# Altium project Hackster1.PrjPcb (part 3 of 4)

## Sheet pca10184_level_shifters.SchDoc: =ProductName + ' - Level Shifters'
size A3; Organization: Nordic Semiconductor; DocumentNumber: 4; SheetNumber: 4; SheetTotal: 9; CompanyName: Nordic Semiconductor; DocumentSize: A4; ProjectName: Hackster1.PrjPcb
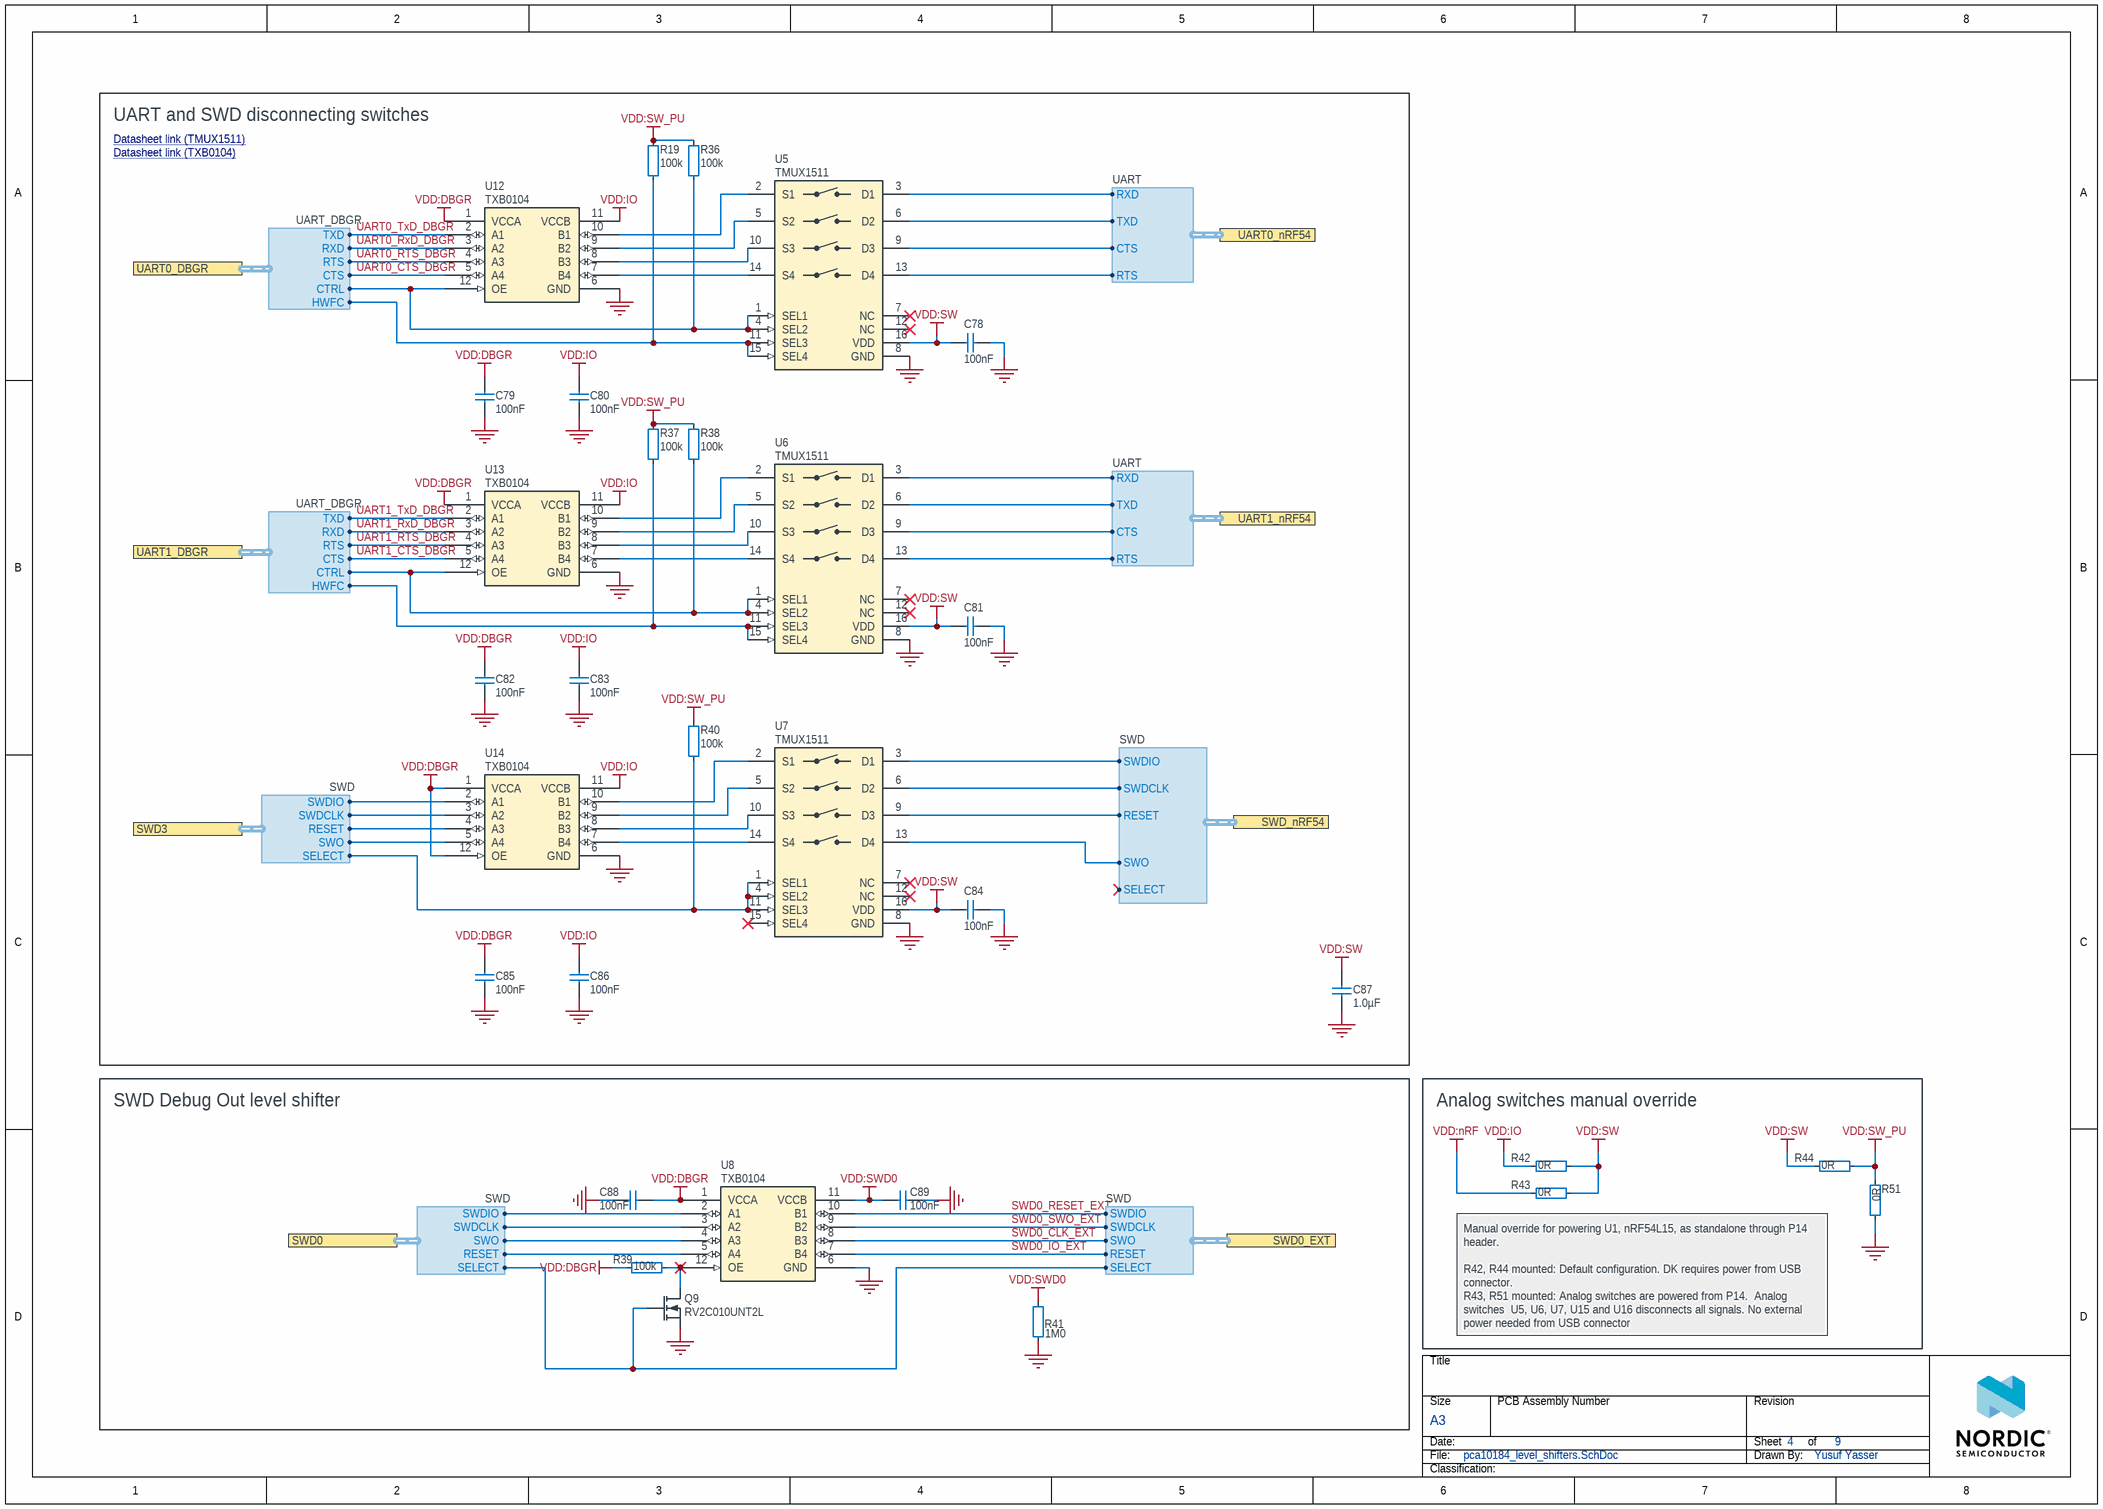
[diagram p7: pca10184_level_shifters.SchDoc]

### Parts
C78  100nF  [CAPC0603X03L_C]
C79  100nF  [CAPC0603X03L_C]
C80  100nF  [CAPC0603X03L_C]
C81  100nF  [CAPC0603X03L_C]
C82  100nF  [CAPC0603X03L_C]
C83  100nF  [CAPC0603X03L_C]
C84  100nF  [CAPC0603X03L_C]
C85  100nF  [CAPC0603X03L_C]
C86  100nF  [CAPC0603X03L_C]
C87  1.0µF  [CAPC1005X04L]
C88  100nF  [CAPC0603X03L_C]
C89  100nF  [CAPC0603X03L_C]
Q9  RV2C010UNT2L  [DFN65P100X40-3L]
R19  100k  [RESC0603X03L_C]
R36  100k  [RESC0603X03L_C]
R37  100k  [RESC0603X03L_C]
R38  100k  [RESC0603X03L_C]
R39  100k  [RESC0603X03L_C]
R40  100k  [RESC0603X03L_C]
R41  1M0  [RESC0603X03L_C]
R42  0R  [RESC1005X04L]
R43  0R  [RESC1005X04L]
R44  0R  [RESC1005X04L]
R51  0R  [RESC1005X04L]
U5  TMUX1511  [XQFN40P180X260X50-16N]
U6  TMUX1511  [XQFN40P180X260X50-16N]
U7  TMUX1511  [XQFN40P180X260X50-16N]
U8  TXB0104  [QFN12P40_170X200X55L50X20]
U12  TXB0104  [QFN12P40_170X200X55L50X20]
U13  TXB0104  [QFN12P40_170X200X55L50X20]
U14  TXB0104  [QFN12P40_170X200X55L50X20]

### Blocks framed on the sheet
UART and SWD disconnecting switches: C78-C87 R19 R36-R38 R40 U5-U7 U12-U14
SWD Debug Out level shifter: C88 C89 Q9 R39 R41 U8
Analog switches manual override: R42-R44 R51

### Ports
SWD0 (harness SWD), SWD0_EXT (harness SWD), SWD3 (harness SWD), SWD_nRF54 (harness SWD), UART0_DBGR (harness UART_DBGR), UART0_nRF54 (harness UART), UART1_DBGR (harness UART_DBGR), UART1_nRF54 (harness UART)

### Harnesses
SWD: SWDIO, SWDCLK, SWO, RESET, SELECT
UART_DBGR: RTS, CTS, RXD, TXD, HWFC, CTRL
UART: RTS, CTS, RXD, TXD

### Nets
GND: C78.2 C79.2 C80.2 C81.2 C82.2 C83.2 C84.2 C85.2 C86.2 C87.1 C88.1 C89.2 Q9.2(S) R41.1 R51.2 U5.8(GND) U6.8(GND) U7.8(GND) U8.6(GND) U12.6(GND) U13.6(GND) U14.6(GND)  [project net ENB]
VDD:DBGR: C79.1 C82.1 C85.1 C88.2 R39.2 U8.1(VCCA) U12.1(VCCA) U13.1(VCCA) U14.1(VCCA) U14.12(OE)
VDD:IO: C80.1 C83.1 C86.1 R42.1 U12.11(VCCB) U13.11(VCCB) U14.11(VCCB)
VDD:nRF: R43.1
VDD:SW: C78.1 C81.1 C84.1 C87.2 R42.2 R43.2 R44.2 U5.16(VDD) U6.16(VDD) U7.16(VDD)
VDD:SW_PU: R19.1 R36.1 R37.1 R38.1 R40.1 R44.1 R51.1
VDD:SWD0: C89.1 R41.2 U8.11(VCCB)
nRF54_RESET: U7.9(D3) ; port SWD_nRF54.RESET
P0.06: U5.6(D2) ; port UART0_nRF54.TXD
P0.07: U5.3(D1) ; port UART0_nRF54.RXD
P0.08: U5.13(D4) ; port UART0_nRF54.RTS
P0.09: U5.9(D3) ; port UART0_nRF54.CTS
P1.16: U6.6(D2) ; port UART1_nRF54.TXD
P1.17: U6.3(D1) ; port UART1_nRF54.RXD
P1.18: U6.13(D4) ; port UART1_nRF54.RTS
P1.19: U6.9(D3) ; port UART1_nRF54.CTS
P2.07: U7.13(D4) ; port SWD_nRF54.SWO
SWD0_CLK_EXT: U8.8(B3) ; port SWD0_EXT.SWO
SWD0_IO_EXT: U8.7(B4) ; port SWD0_EXT.RESET
SWD0_RESET_EXT: U8.10(B1) ; port SWD0_EXT.SWDIO
SWD0_SWO_EXT: U8.9(B2) ; port SWD0_EXT.SWDCLK
SWDCLK: U7.6(D2) ; port SWD_nRF54.SWDCLK
SWDIO: U7.3(D1) ; port SWD_nRF54.SWDIO
UART0_CTS_DBGR: U12.5(A4) ; port UART0_DBGR.CTS
UART0_RTS_DBGR: U12.4(A3) ; port UART0_DBGR.RTS
UART0_RxD_DBGR: U12.3(A2) ; port UART0_DBGR.RXD
UART0_TxD_DBGR: U12.2(A1) ; port UART0_DBGR.TXD
UART1_CTS_DBGR: U13.5(A4) ; port UART1_DBGR.CTS
UART1_RTS_DBGR: U13.4(A3) ; port UART1_DBGR.RTS
UART1_RxD_DBGR: U13.3(A2) ; port UART1_DBGR.RXD
UART1_TxD_DBGR: U13.2(A1) ; port UART1_DBGR.TXD
NetQ9_1: Q9.1(G) ; port SWD0.SELECT, port SWD0_EXT.SELECT
NetQ9_3: Q9.3(D) R39.1 U8.12(OE)
NetR19_2: R19.2 U5.11(SEL3) U5.15(SEL4) ; port UART0_DBGR.HWFC
NetR36_2: R36.2 U5.1(SEL1) U5.4(SEL2) U12.12(OE) ; port UART0_DBGR.CTRL
NetR37_2: R37.2 U6.11(SEL3) U6.15(SEL4) ; port UART1_DBGR.HWFC
NetR38_2: R38.2 U6.1(SEL1) U6.4(SEL2) U13.12(OE) ; port UART1_DBGR.CTRL
NetR40_2: R40.2 U7.1(SEL1) U7.4(SEL2) U7.11(SEL3) ; port SWD3.SELECT
NetU5_2: U5.2(S1) U12.10(B1)
NetU5_5: U5.5(S2) U12.9(B2)
NetU5_10: U5.10(S3) U12.8(B3)
NetU5_14: U5.14(S4) U12.7(B4)
NetU6_2: U6.2(S1) U13.10(B1)
NetU6_5: U6.5(S2) U13.9(B2)
NetU6_10: U6.10(S3) U13.8(B3)
NetU6_14: U6.14(S4) U13.7(B4)
NetU7_2: U7.2(S1) U14.10(B1)
NetU7_5: U7.5(S2) U14.9(B2)
NetU7_10: U7.10(S3) U14.8(B3)
NetU7_14: U7.14(S4) U14.7(B4)
NetU8_2: U8.2(A1) ; port SWD0.SWDIO
NetU8_3: U8.3(A2) ; port SWD0.SWDCLK
NetU8_4: U8.4(A3) ; port SWD0.SWO
NetU8_5: U8.5(A4) ; port SWD0.RESET
NetU14_2: U14.2(A1) ; port SWD3.SWDIO
NetU14_3: U14.3(A2) ; port SWD3.SWDCLK
NetU14_4: U14.4(A3) ; port SWD3.RESET
NetU14_5: U14.5(A4) ; port SWD3.SWO

Not connected (* = marked no-connect by the designer): U5 7(NC)* 12(NC)*; U6 7(NC)* 12(NC)*; U7 7(NC)* 12(NC)* 15(SEL4)*

### Notes on the sheet
- Datasheet link (TMUX1511) <https://www.ti.com/lit/ds/symlink/tmux1511.pdf?ts=1730882090102&ref_url=https%253A%252F%252Fwww.mouser.dk%252F>
- Datasheet link (TXB0104) <https://www.ti.com/lit/ds/symlink/txb0104.pdf?src-supplier=IHS+Markit>
- (near R43) Manual override for powering U1, nRF54L15, as standalone through P14 header.
  R42, R44 mounted: Default configuration. DK requires power from USB connector.
  R43, R51 mounted: Analog switches are powered from P14.  Analog switches  U5, U6, U7, U15 and U16 disconnects all signals. No external power needed from USB connector
- Title
- Size
- Date:
- File:
- A3
- PCB Assembly Number
- Sheet
- Drawn By:
- Revision
- of
- Classification:

### Library data of the parts
C78-C86 C88 C89 = C0201-100n: Capacitor, X5R, ±10%; Manufacturer: N.A.; Part number IPS: 00000001248, 00000002505; Part number Norautron: 262071862; Part number NEMS: 100200078; Pad Count: 2; Note: 16V; Component Status: Active; Part Number: C0201-100n; Value: 100nF; Footprint Doc: 0201; Component Class: Capacitors; Author: rsk; PartId: 100200078; Manufacturer Part Number: N.A.; ComponentLink1URL: N.A.; ComponentLink1Description: Datasheet; ComponentLink2URL: N.A.; ComponentLink2Description: Supplier link; HelpURL: N.A.; LatestRevisionDate: 2017-11-09; Published: 2014-11-13; Supplier 1: N.A.; Supplier Part Number 1: N.A.; Supplier 2: N.A.; Supplier Part Number 2: N.A.; Artikkelnr Noca: N.A.
C87 = C0402-1µ0-6.3V-X5R-10%: Capacitor, X5R, ±10%, 6.3V; Manufacturer: N.A.; Part number Norautron: 26207137; Part number NEMS: 100200498; Pad Count: 2; Component Status: Active; Part Number: C0402-1µ0-6.3V-X5R-10%; Manufacturer Part Number: N.A.; LatestRevisionDate: 2022-01-27; Published: 2022-01-27; Value: 1.0µF; Note: 6.3V; Artikkelnr Noca: N.A.; Footprint Doc: 0402; ComponentLink1URL: N.A.; ComponentLink1Description: Datasheet; ComponentLink2URL: N.A.; ComponentLink2Description: Supplier link; HelpURL: N.A.; Supplier 1: N.A.; Supplier Part Number 1: N.A.; Supplier 2: N.A.; Supplier Part Number 2: N.A.; Part number IPS: N.A.; Component Class: Capacitors; PartId: 100200498; Author: rubr
Q9 = RV2C010UNT2L: N-Channel MOSFET, 20V, 1A, 470mOhm, 400mW, -55°C ~ 150°C; Manufacturer: Rohm Semiconductor; Part number IPS: 00000009976; Part number Norautron: 26320026; Part number NEMS: 101300132; Note: N.A.; Artikkelnr Noca: 35010020; Pad Count: 3; Component Status: Active; Part Number: RV2C010UNT2L; Manufacturer Part Number: RV2C010UNT2L; ComponentLink1URL: N.A.; ComponentLink1Description: Datasheet; ComponentLink2URL: N.A.; ComponentLink2Description: Supplier link; HelpURL: http://rohmfs.rohm.com/en/products/databook/datasheet/discrete/transistor/mosfet/rv2c010unt2l-e.pdf; Footprint Doc: DFN-3; LatestRevisionDate: 2024-09-18; Published: 2016-08-09; Value: RV2C010UNT2L; Supplier 1: Digi-Key; Supplier Part Number 1: RV2C010UNT2LCT-ND; Supplier 2: Mouser; Supplier Part Number 2: 755-RV2C010UNT2L; PartId: 101300132; Component Class: Semiconductors; Author: rsk
R19 R36-R40 = R0201-100k: Resistor, ±1%, 0.05W; Manufacturer: N.A.; Part number IPS: 00000001419; Part number Norautron: 26108487; Part number NEMS: 100100080; Note: Chip Res 1%; Pad Count: 2; Component Status: Active; Part Number: R0201-100k; Manufacturer Part Number: N.A.; ComponentLink1URL: N.A.; ComponentLink1Description: Datasheet; ComponentLink2URL: N.A.; ComponentLink2Description: Supplier link; HelpURL: N.A.; Footprint Doc: 0201; LatestRevisionDate: 2014-11-13; Published: 2014-11-13; Value: 100k; Artikkelnr Noca: N.A.; Supplier 1: N.A.; Supplier Part Number 1: N.A.; Supplier 2: N.A.; Supplier Part Number 2: N.A.; Component Class: Resistors; PartId: 100100080; Author: rsk
R41 = R0201-1M0: Resistor, ±1%, 0.05W; Manufacturer: N.A.; Part number IPS: 00000001418; Part number Norautron: 26107108; Part number NEMS: 100100093; Component Status: Active; Pad Count: 2; Note: Chip Res 1%; Part Number: R0201-1M0; PartId: 100100093; Component Class: Resistors; Author: rsk; Manufacturer Part Number: N.A.; ComponentLink1URL: N.A.; ComponentLink1Description: Datasheet; ComponentLink2URL: N.A.; ComponentLink2Description: Supplier link; HelpURL: N.A.; LatestRevisionDate: 2014-11-13; Published: 2014-11-13; Footprint Doc: 0201; Value: 1M0; Supplier 1: N.A.; Supplier Part Number 1: N.A.; Supplier 2: N.A.; Supplier Part Number 2: N.A.; Artikkelnr Noca: N.A.
R42-R44 R51 = R0402-0R: Resistor, ±5%, 0.063W; Manufacturer: N.A.; Part number IPS: 00000007128; Part number NEMS: 100100109; Component Status: Active; Pad Count: 2; Note: Chip Res 5%; Artikkelnr Noca: 27049000; Part Number: R0402-0R; PartId: 100100109; Component Class: Resistors; Author: rsk; Manufacturer Part Number: N.A.; ComponentLink1URL: N.A.; ComponentLink1Description: Datasheet; ComponentLink2URL: N.A.; ComponentLink2Description: Supplier link; HelpURL: N.A.; LatestRevisionDate: 2009-11-23; Published: 2009-05-08; Footprint Doc: 0402; Value: 0R; Supplier 1: Farnell; Supplier Part Number 1: 146-9661; Supplier 2: N.A.; Supplier Part Number 2: N.A.; Part number Norautron: N.A.
U5-U7 = TMUX1511: Low-Capacitance, 1:1 (SPST) 4-Channel, analog switch; Manufacturer: Texas Instruments; Manufacturer Part Number: TMUX1511RSVR; Part number NEMS: 101900847; Component Status: Active; Pad Count: 16; Note: N.A.; Part Number: TMUX1511; Component Class: Misc_ICs; Author: stl1; ComponentLink1URL: https://www.ti.com/lit/ds/symlink/tmux1511.pdf?ts=1730882090102&ref_url=https%253A%252F%252Fwww.mouser.dk%252F; ComponentLink1Description: Datasheet; ComponentLink2URL: N.A.; ComponentLink2Description: Supplier link; HelpURL: https://www.ti.com/lit/ds/symlink/tmux1511.pdf?ts=1730882090102&ref_url=https%253A%252F%252Fwww.mouser.dk%252F; LatestRevisionDate: 2024-12-05; Published: 2024-12-05; Footprint Doc: UFQFN-16; Value: TMUX1511; Supplier 1: Digi-Key; Supplier Part Number 1: 296-53443-2-ND; Supplier 2: Mouser; Supplier Part Number 2: 595-TMUX1511RSVR; Artikkelnr Noca: N.A.; Part number IPS: N.A.; Part number Norautron: N.A.; PartId: 101900847
U8 U12-U14 = TXB0104RUTR: 4-Bit Bidirectional Level-Shifter/Voltage Translator with Automatic Direction Sensing; Manufacturer: Texas Instruments; Part number NEMS: 101900856; Component Status: Active; Pad Count: 12; Note: Translator, Bidirectional; Artikkelnr Noca: N.A.; Part Number: TXB0104RUTR; Component Class: Misc_ICs; Author: stl1; Manufacturer Part Number: TXB0104RUTR; ComponentLink1URL: N.A.; ComponentLink1Description: Datasheet; ComponentLink2URL: N.A.; ComponentLink2Description: Supplier link; HelpURL: https://www.ti.com/lit/ds/symlink/txb0104.pdf?ts=1738584719537&ref_url=https%253A%252F%252Fwww.mouser.com%252F; LatestRevisionDate: 2025-02-04; Published: 2025-02-04; Footprint Doc: 12-UFQFN; Value: TXB0104; Supplier 1: Digi-Key; Supplier Part Number 1: 296-25888-2-ND; Supplier 2: Mouser; Supplier Part Number 2: 595-TXB0104RUTR; Part number IPS: N.A.; Part number Norautron: N.A.; PartId: 101900856

## Sheet pca10184_switches.SchDoc: =BoardTitle+' - QSPI Switching'
size A3; Organization: Nordic Semiconductor; DocumentNumber: 7; SheetNumber: 7; SheetTotal: 9; CompanyName: Nordic Semiconductor; DocumentSize: A4; ProjectName: Hackster1.PrjPcb
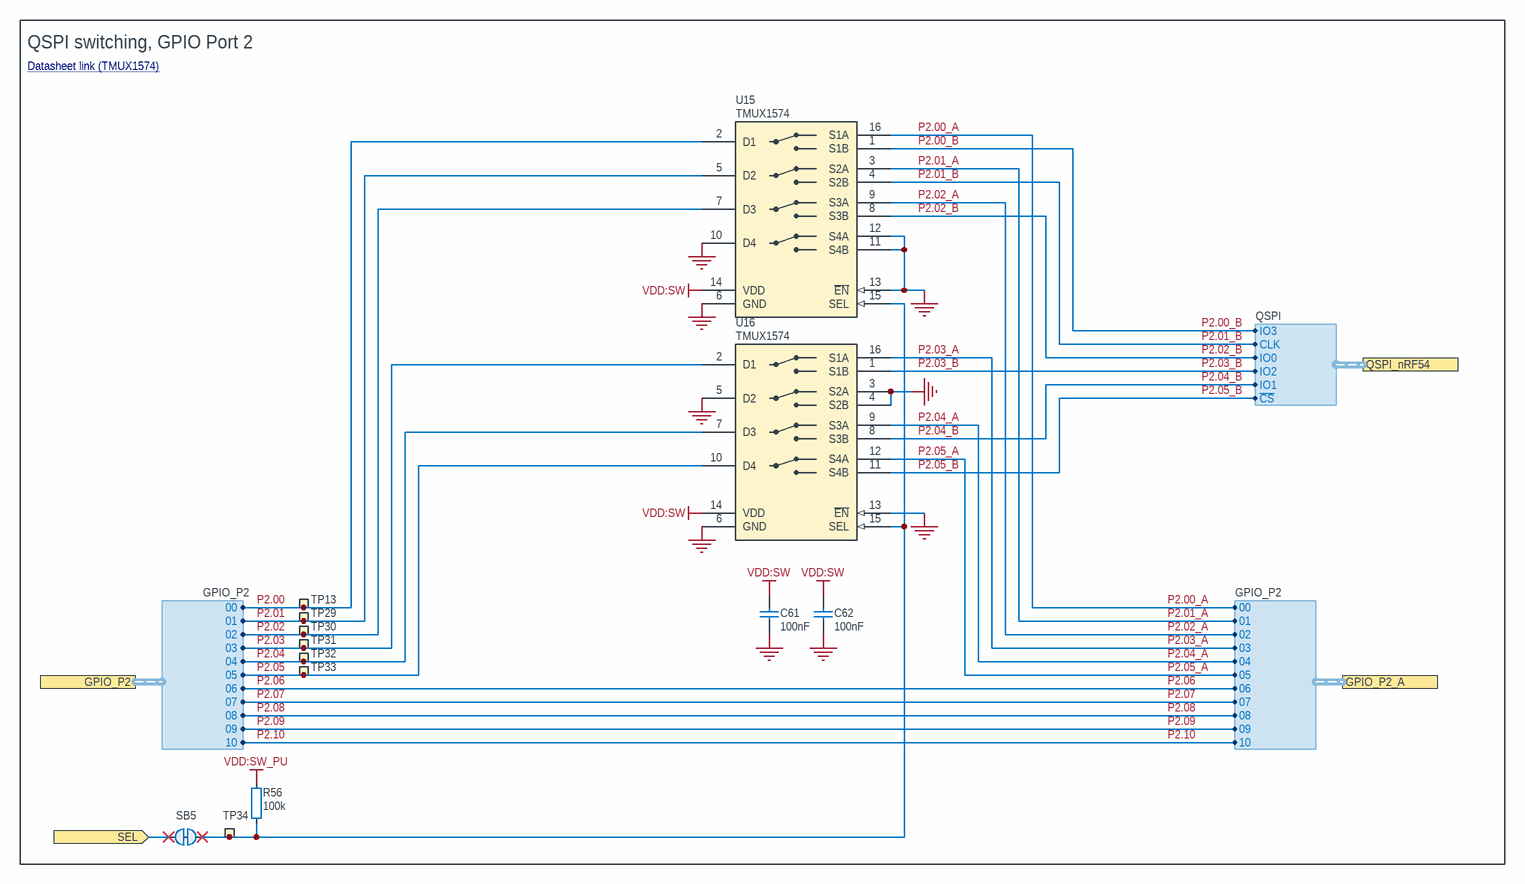
[diagram p8: pca10184_switches.SchDoc]

### Parts
C61  100nF  [CAPC0603X03L_C]
C62  100nF  [CAPC0603X03L_C]
R56  100k  [RESC0603X03L_C]
SB5  Solderbridge  [Solderbridge_Shorted]  (value not drawn)  (net tie, no BOM)
TP13  Ø0.7mm,SMD  [TP_SMD_D0.7mm]  (value not drawn)  (no BOM)
TP29  Ø0.7mm,SMD  [TP_SMD_D0.7mm]  (value not drawn)  (no BOM)
TP30  Ø0.7mm,SMD  [TP_SMD_D0.7mm]  (value not drawn)  (no BOM)
TP31  Ø0.7mm,SMD  [TP_SMD_D0.7mm]  (value not drawn)  (no BOM)
TP32  Ø0.7mm,SMD  [TP_SMD_D0.7mm]  (value not drawn)  (no BOM)
TP33  Ø0.7mm,SMD  [TP_SMD_D0.7mm]  (value not drawn)  (no BOM)
TP34  Ø0.7mm,SMD  [TP_SMD_D0.7mm]  (value not drawn)  (no BOM)
U15  TMUX1574  [XQFN40P180X260X50-16N]
U16  TMUX1574  [XQFN40P180X260X50-16N]

### Ports
GPIO_P2 (harness GPIO_P2), GPIO_P2_A (harness GPIO_P2), QSPI_nRF54 (harness QSPI), SEL (in)

### Harnesses
GPIO_P2: 00, 01, 02, 03, 04, 05, 06, 07, 08, 09, 10
QSPI: ~{CS}, IO0, CLK, IO1, IO2, IO3

### Nets
GND: C61.2 C62.2 U15.6(GND) U15.10(D4) U15.11(S4B) U15.12(S4A) U15.13(~{EN}) U16.3(S2A) U16.4(S2B) U16.5(D2) U16.6(GND) U16.13(~{EN})  [project net ENB]
VDD:SW: C61.1 C62.1 U15.14(VDD) U16.14(VDD)
VDD:SW_PU: R56.2
P2.00: TP13.1 U15.2(D1) ; port GPIO_P2.00
P2.00_A: U15.16(S1A) ; port GPIO_P2_A.00
P2.00_B: U15.1(S1B) ; port QSPI_nRF54.IO3
P2.01: TP29.1 U15.5(D2) ; port GPIO_P2.01
P2.01_A: U15.3(S2A) ; port GPIO_P2_A.01
P2.01_B: U15.4(S2B) ; port QSPI_nRF54.CLK
P2.02: TP30.1 U15.7(D3) ; port GPIO_P2.02
P2.02_A: U15.9(S3A) ; port GPIO_P2_A.02
P2.02_B: U15.8(S3B) ; port QSPI_nRF54.IO0
P2.03: TP31.1 U16.2(D1) ; port GPIO_P2.03
P2.03_A: U16.16(S1A) ; port GPIO_P2_A.03
P2.03_B: U16.1(S1B) ; port QSPI_nRF54.IO2
P2.04: TP32.1 U16.7(D3) ; port GPIO_P2.04
P2.04_A: U16.9(S3A) ; port GPIO_P2_A.04
P2.04_B: U16.8(S3B) ; port QSPI_nRF54.IO1
P2.05: TP33.1 U16.10(D4) ; port GPIO_P2.05
P2.05_A: U16.12(S4A) ; port GPIO_P2_A.05
P2.05_B: U16.11(S4B) ; port QSPI_nRF54.~{CS}
P2.06: port GPIO_P2.06, port GPIO_P2_A.06
P2.07: port GPIO_P2.07, port GPIO_P2_A.07
P2.08: port GPIO_P2.08, port GPIO_P2_A.08
P2.09: port GPIO_P2.09, port GPIO_P2_A.09
P2.10: port GPIO_P2.10, port GPIO_P2_A.10
NetR56_1: R56.1 SB5.2 TP34.1 U15.15(SEL) U16.15(SEL)
NetSB5_1: SB5.1 ; port SEL

### Notes on the sheet
- QSPI switching, GPIO Port 2
- Datasheet link (TMUX1574) <https://www.ti.com/lit/ds/symlink/tmux1574.pdf?ts=1730869182960>
- Title
- Size
- Date:
- File:
- A3
- PCB Assembly Number
- Sheet
- Drawn By:
- Revision
- of
- Classification:

### Library data of the parts
C61 C62 = C0201-100n: as C78-C86 on sheet pca10184_level_shifters; Part Number: C0201-100n; LatestRevisionDate: 2017-11-09; Published: 2014-11-13; Value: 100nF; Footprint Doc: 0201; Component Class: Capacitors; PartId: 100200078; Author: rsk; Manufacturer Part Number: N.A.; ComponentLink1URL: N.A.; ComponentLink1Description: Datasheet; ComponentLink2URL: N.A.; ComponentLink2Description: Supplier link; HelpURL: N.A.; Supplier 1: N.A.; Supplier Part Number 1: N.A.; Supplier 2: N.A.; Supplier Part Number 2: N.A.; Artikkelnr Noca: N.A.
R56 = R0201-100k: as R19 on sheet pca10184_level_shifters; Part Number: R0201-100k; Manufacturer Part Number: N.A.; ComponentLink1URL: N.A.; ComponentLink1Description: Datasheet; ComponentLink2URL: N.A.; ComponentLink2Description: Supplier link; HelpURL: N.A.; Footprint Doc: 0201; LatestRevisionDate: 2014-11-13; Published: 2014-11-13; Value: 100k; Artikkelnr Noca: N.A.; Supplier 1: N.A.; Supplier Part Number 1: N.A.; Supplier 2: N.A.; Supplier Part Number 2: N.A.; Component Class: Resistors; PartId: 100100080; Author: rsk
SB5 = Solderbridge Shorted: Shorted Solderbridge; Manufacturer: N.A.; Part number NEMS: 100500459; Pad Count: 2; Component Status: Active; System: Connector; Part Number: Solderbridge Shorted; Manufacturer Part Number: N.A.; LatestRevisionDate: 2012-08-07; Published: 2012-08-07; Value: Solderbridge; Note: N.A.; Artikkelnr Noca: N.A.; Footprint Doc: Solderbridge_Shorted; Part number IPS: N.A.; ComponentLink1URL: N.A.; ComponentLink1Description: Datasheet; ComponentLink2URL: N.A.; ComponentLink2Description: Supplier link; HelpURL: N.A.; Supplier 1: N.A.; Supplier Part Number 1: N.A.; Supplier 2: N.A.; Supplier Part Number 2: N.A.; Component Class: Connectors; PartId: 100500459; Author: rsk; Part number Norautron: N.A.
TP13 TP29-TP34 = TP_SMD_Ø0.7MM: 0.7mm circular SMD testpad; Manufacturer: Nordic Semiconductor; Manufacturer Part Number: N.A.; Part number NEMS: 100500474; Component Status: Active; Pad Count: 1; Part Number: TP_SMD_Ø0.7MM; PartId: 100500474; Component Class: Connectors; Author: rsk; ComponentLink1URL: N.A.; ComponentLink1Description: Datasheet; ComponentLink2URL: N.A.; ComponentLink2Description: Supplier link; HelpURL: N.A.; LatestRevisionDate: 2021-03-05; Published: 2017-12-14; Footprint Doc: TP_SMD_Ø0.7mm; Value: Ø0.7mm,SMD; Note: N.A.; Supplier 1: N.A.; Supplier Part Number 1: N.A.; Supplier 2: N.A.; Supplier Part Number 2: N.A.; Artikkelnr Noca: N.A.; Part number IPS: N.A.; Part number Norautron: N.A.
U15 U16 = TMUX1574: Low-Capacitance, 2:1 (SPDT) 4-Channel, analog switch; Manufacturer: Texas Instruments; Manufacturer Part Number: TMUX1574RSVR; Part number NEMS: 101900850; Component Status: Active; Pad Count: 16; Note: N.A.; Part Number: TMUX1574; Component Class: Misc_ICs; Author: stl1; ComponentLink1URL: https://www.ti.com/lit/ds/symlink/tmux1574.pdf?ts=1730869182960; ComponentLink1Description: Datasheet; ComponentLink2URL: N.A.; ComponentLink2Description: Supplier link; HelpURL: https://www.ti.com/lit/ds/symlink/tmux1574.pdf?ts=1730869182960; LatestRevisionDate: 2024-11-20; Published: 2024-11-20; Footprint Doc: UFQFN-16; Value: TMUX1574; Supplier 1: Digi-Key; Supplier Part Number 1: 296-53445-2-ND; Supplier 2: Mouser; Supplier Part Number 2: 595-TMUX1574RSVR; Artikkelnr Noca: N.A.; Part number IPS: N.A.; Part number Norautron: N.A.; PartId: 101900850

## Sheet MAX3485Schmematic.SchDoc: Rs
size A4; DrawnBy: Yusuf Yasser; SheetNumber: 3; SheetTotal: 17
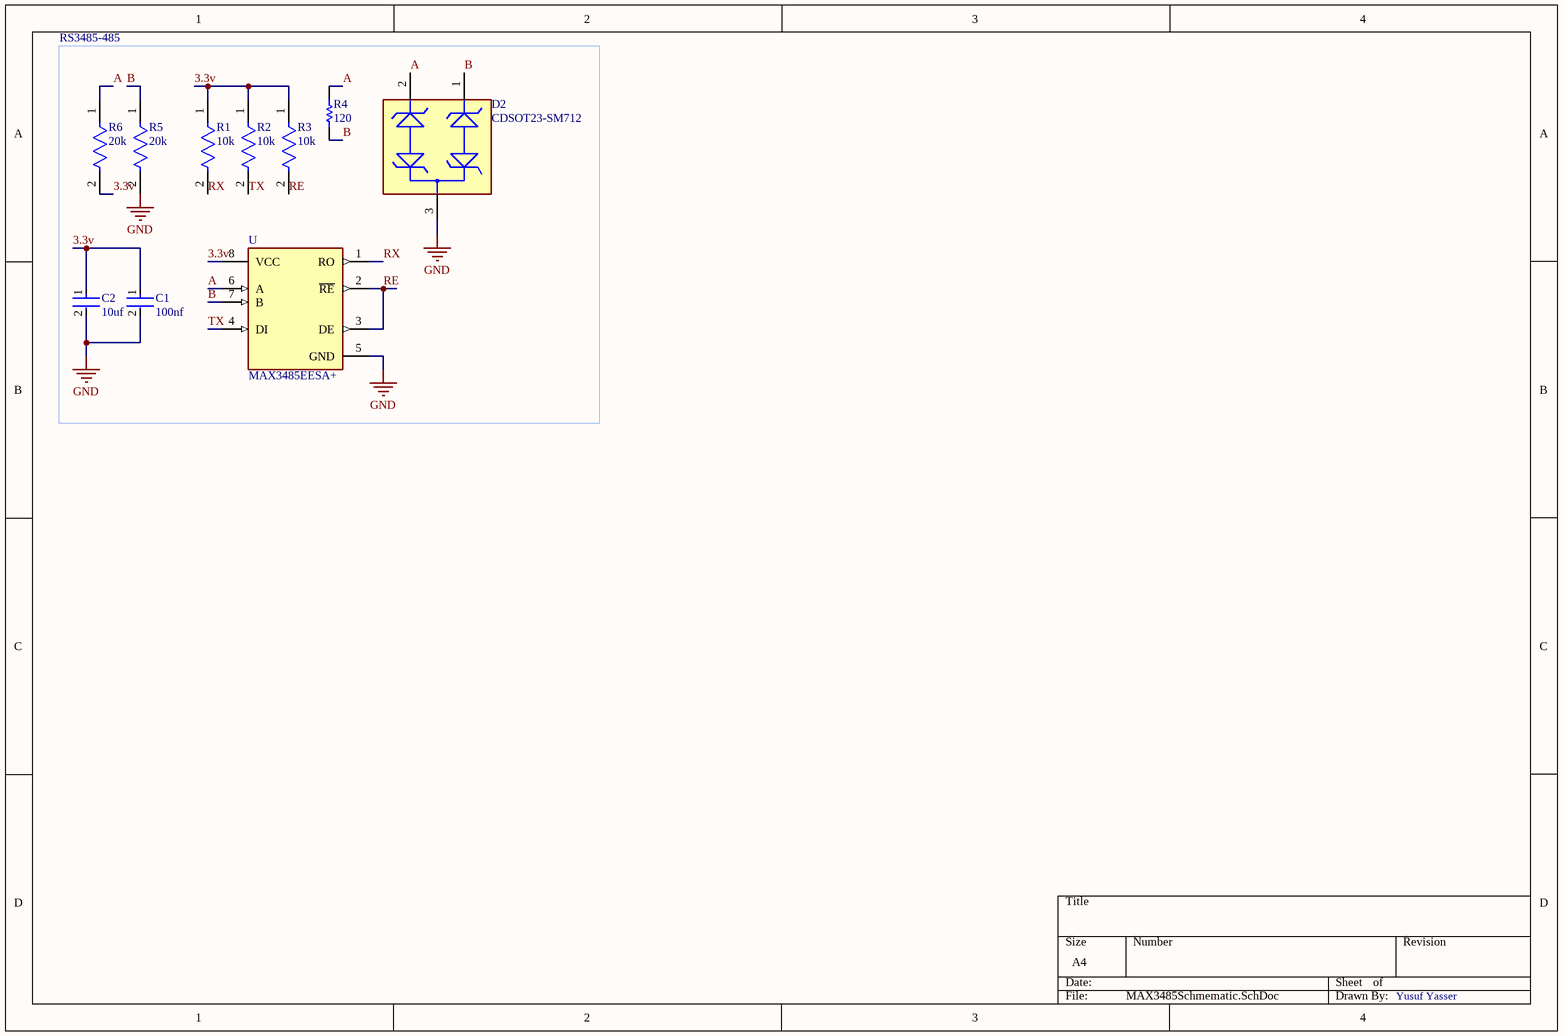
[diagram p9: MAX3485Schmematic.SchDoc]

### Parts
(Parts that share a designator on the sheet are numbered #1, #2 ... from top to bottom, then left to right.)
C1#2  100nf  [FP-CGA1A-0_1-0_03-IPC_A]
C2#2  10uf  [FP-KRM55L-6_1_5_3_3_1_2-C-MFG]
D2#1  CDSOT23-SM712  [FP-SOT23-MFG]
R1#2  10k  [FP-CRGCQ1206-IPC_C]
R2#2  10k  [FP-CRGCQ1206-IPC_C]
R3#2  10k  [FP-CRGCQ1206-IPC_C]
R4#2  120  [RESC3225X60X45NL20T20]
R5#1  20k  [FP-RP732B-MFG]
R6  20k  [FP-RP732B-MFG]
U  MAX3485EESA+  [FP-S8-5-MFG]

### Blocks framed on the sheet
RS3485-485: C1#2 C2#2 D2#1 R1#2 R2#2 R3#2 R4#2 R5#1 R6 U

### Nets
GND: C1#2.2 C2#2.2 D2#1.3 R5#1.2 U.5(GND)  [project net ENB]
3.3v: C1#2.1 C2#2.1 R1#2.1 R2#2.1 R3#2.1 R6.2 U.8(VCC)
A: D2#1.2 R4#2.1 R6.1 U.6(A)
B: D2#1.1 R4#2.2 R5#1.1 U.7(B)
RE: R3#2.2 U.2(~{RE}) U.3(DE)
RX: R1#2.2 U.1(RO)
TX: R2#2.2 U.4(DI)

### Notes on the sheet
- Yusuf Yasser

### Library data of the parts
C1#2 = CMP-08246-000333-1: AUTOMOTIVE GRADE,0201,X7T,4V,0.1
C2#2 = CMP-06035-048273-1: Cap Ceramic Multilayer 10uF 35V ±10% 2220 Emboss T/R
D2#1 = CMP-2000-05081-2: TVS DIODE 7V/12V 14V/26V SOT23-3; Manufacturer: Bourns Inc.; Peak Pulse Current: 17A; Standoff Height: 0.05mm; Breakdown Voltage: 7.5V; Direction: Bidirectional; Clamping Voltage: 26V; Value: 75pF; Number Of Channels: 2; Reverse Standoff Voltage: 12V; Peak Pulse Power: 400W; Temperature Range Low: -55°C; Mouser Description: Transient Voltage Suppressor, TVS, CDSOT23 Series, Unidirectional, 12 V, SOT-23, 3, 13.3 V; Device Class L3: unset; Package: SOT23; Height: 1.17mm; RoHS: TRUE; Octopart: https://octopart.com/cdsot23-sm712-bourns-7576327; Category: Diode; Ipc Land Pattern Name: SOT95P229X103-3; ComponentLink2URL: https://www.bourns.com/docs/Product-Datasheets/CDSOT23-SM712.pdf; Temperature Range High: +150°C; ComponentLink2Description: Datasheet; Digikey Description: TVS DIODE 7V/12V 14V/26V SOT23-3; Manufacturer Part Number: CDSOT23-SM712; Temperature: -55°C to +150°C; Device Class L2: TVS Diodes; Lead Free: Yes; Device Class L1: Circuit Protection; Automotive: No; Capacitance: 75pF
R1#2 R2#2 R3#2 = CMP-03211-010884-1: CRGCQ1206 10KΩ 0.25W 1% ±100ppm/°C 200V; Manufacturer: TE Connectivity; Manufacturer Part Number: CRGCQ1206F10K; Tolerance: 0.01; Automotive Grade: Grade 913; Value: 10KΩ; Automotive: Yes; Temperature: -55°C to +155°C; RoHS: TRUE; Series: CRGCQ; Lead Free: Yes; Device Class L3: Chip SMD Resistors; Package: CRGCQ1206; ComponentLink2URL: https://www.te.com/commerce/DocumentDelivery/DDEController?Action=showdoc&DocId=Data+Sheet%7F1773204-3%7F1%7Fpdf%7FEnglish%7FENG_DS_1773204-3_1.pdf%7F4-2176347-922; Ipc Land Pattern Name: RESC310155X55; Composition: Thick Film; Voltage Rating: 200V; Device Class L1: Passive Components; Temperature Range Low: -55°C; Resistance: 10KΩ; Height: 0.65mm; Power Rating: 0.25W; Device Class L2: Resistors; Temperature Range High: +155°C; Octopart: https://octopart.com/crgcq1206f10k-te+connectivity-91018244; Ambient Temperature Range High: +70°C; ComponentLink2Description: Datasheet; Temperature Coefficient: ±100ppm/°C; Category: Res
R4#2 = CMP-2005-00658-1: Manufacturer: Vishay Dale; Part Number: CRCW1210120RJNTA
R5#1 R6 = CMP-03211-001372-1: Res Thin Film 1206 20KΩ 0.1% 0.25W 15ppm/°C Molded SMD; Manufacturer Part Number: RP73D2B20KBTG; Manufacturer: TE Connectivity; Voltage Rating: 200V; Height: 0.65mm; Ipc Land Pattern Name: RESC305155X55; octopart_url: https://octopart.com/rp73d2b20kbtg-te+connectivity-42012488; RoHS: TRUE; Value: 20KΩ; Temperature: -55°C to 155°C; packaging: 250 cut tape length; ComponentLink2Description: Datasheet; Device Class L1: Passive Components; Category: Res; Resistance: 20KΩ; Automotive: No; ComponentLink2URL: https://www.te.com/commerce/DocumentDelivery/DDEController?Action=showdoc&DocId=Data+Sheet%7F1773272%7FL%7Fpdf%7FEnglish%7FENG_DS_1773272_L.pdf%7F8-1879255-6; Composition: Thin Film; Temperature Range Low: -55°C; Device Class L3: Chip SMD Resistors; Temperature Coefficient: 15ppm/°C; Octopart: https://octopart.com/rp73d2b20kbtg-te+connectivity-42012488; Power Rating: 0.25W; Tolerance: 0.1%; Lead Free: Yes; Package: RP732B; Series: RP73; Temperature Range High: 155°C; Device Class L2: Resistors
U = CMP-05679-000038-1: IC TXRX RS485/422 10MBPS 8SOIC; Manufacturer: Maxim Integrated; Number Of Receivers: 1; Simplex Duplex: Half Duplex; Data Rate: 15Mbits/s; Interface: RS-485,RS-422; Max Supply Voltage: 3.6V; Nominal Supply Current: 0.95-1.1mA; Min Supply Voltage: 3V; Standoff Height: 0.1mm; Mouser Description: RS-422/RS-485 Interface IC 3.3V 12Mbps Transceiver; Lead Free: Yes; Footprint Url: https://pdfserv.maximintegrated.com/land_patterns/90-0096.PDF; Device Class L1: Integrated Circuits (ICs); Device Class L3: RS-232 / RS-422 / RS-485 Interface ICs; RoHS: TRUE; Height: 1.75mm; ComponentLink2URL: https://datasheets.maximintegrated.com/en/ds/MAX3483E-MAX3491E.pdf; Temperature Range High: +85°C; Temperature: -40°C to +85°C; Manufacturer Part Number: MAX3485EESA+; Number Of Transmitters: 1; Device Class L2: Interface ICs; Octopart: https://octopart.com/max3485eesa%2B-maxim+integrated-39731903; ComponentLink2Description: Datasheet; Category: IC; Digikey Description: IC TXRX RS485/422 10MBPS 8SOIC; Automotive: No; Temperature Range Low: -40°C; Package: S8-5

## Sheet Mechanical_design_of_the_sensor.SchDoc
size A4; DrawnBy: Yusuf Yasser; SheetNumber: 3; SheetTotal: 11
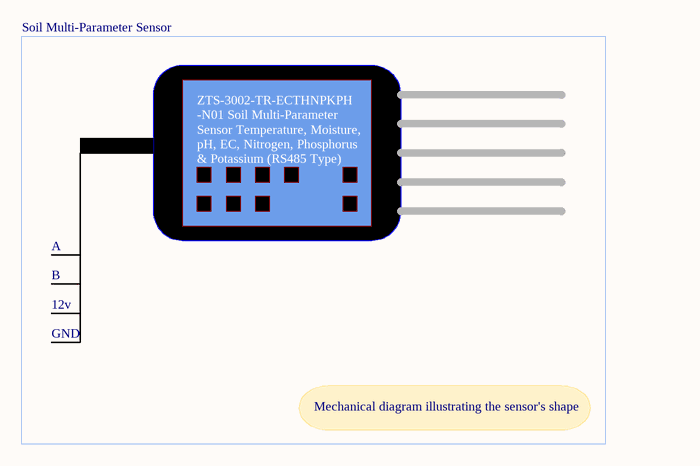
[diagram p10: Mechanical_design_of_the_sensor.SchDoc]

### Notes on the sheet
- Soil Multi-Parameter Sensor
- ZTS-3002-TR-ECTHNPKPH
- -N01 Soil Multi-Parameter
- Sensor Temperature, Moisture,
- pH, EC, Nitrogen, Phosphorus
- & Potassium (RS485 Type)
- A
- B
- 12v
- GND
- Mechanical diagram illustrating the sensor's shape

## Sheet 1_LiPo_Charger.schdoc
size 289 x 200 mm; Name: default297x210; Symbol: default297x210; Device: default297x210; Size: "A4"; Id: /; File: LiPo Charger; Sheet: /; SheetNumber: 12; SheetTotal: 17
Used 2 times, as channels Battery Charger, Battery Charger. Parts and nets are listed once, with the designators drawn on the sheet.
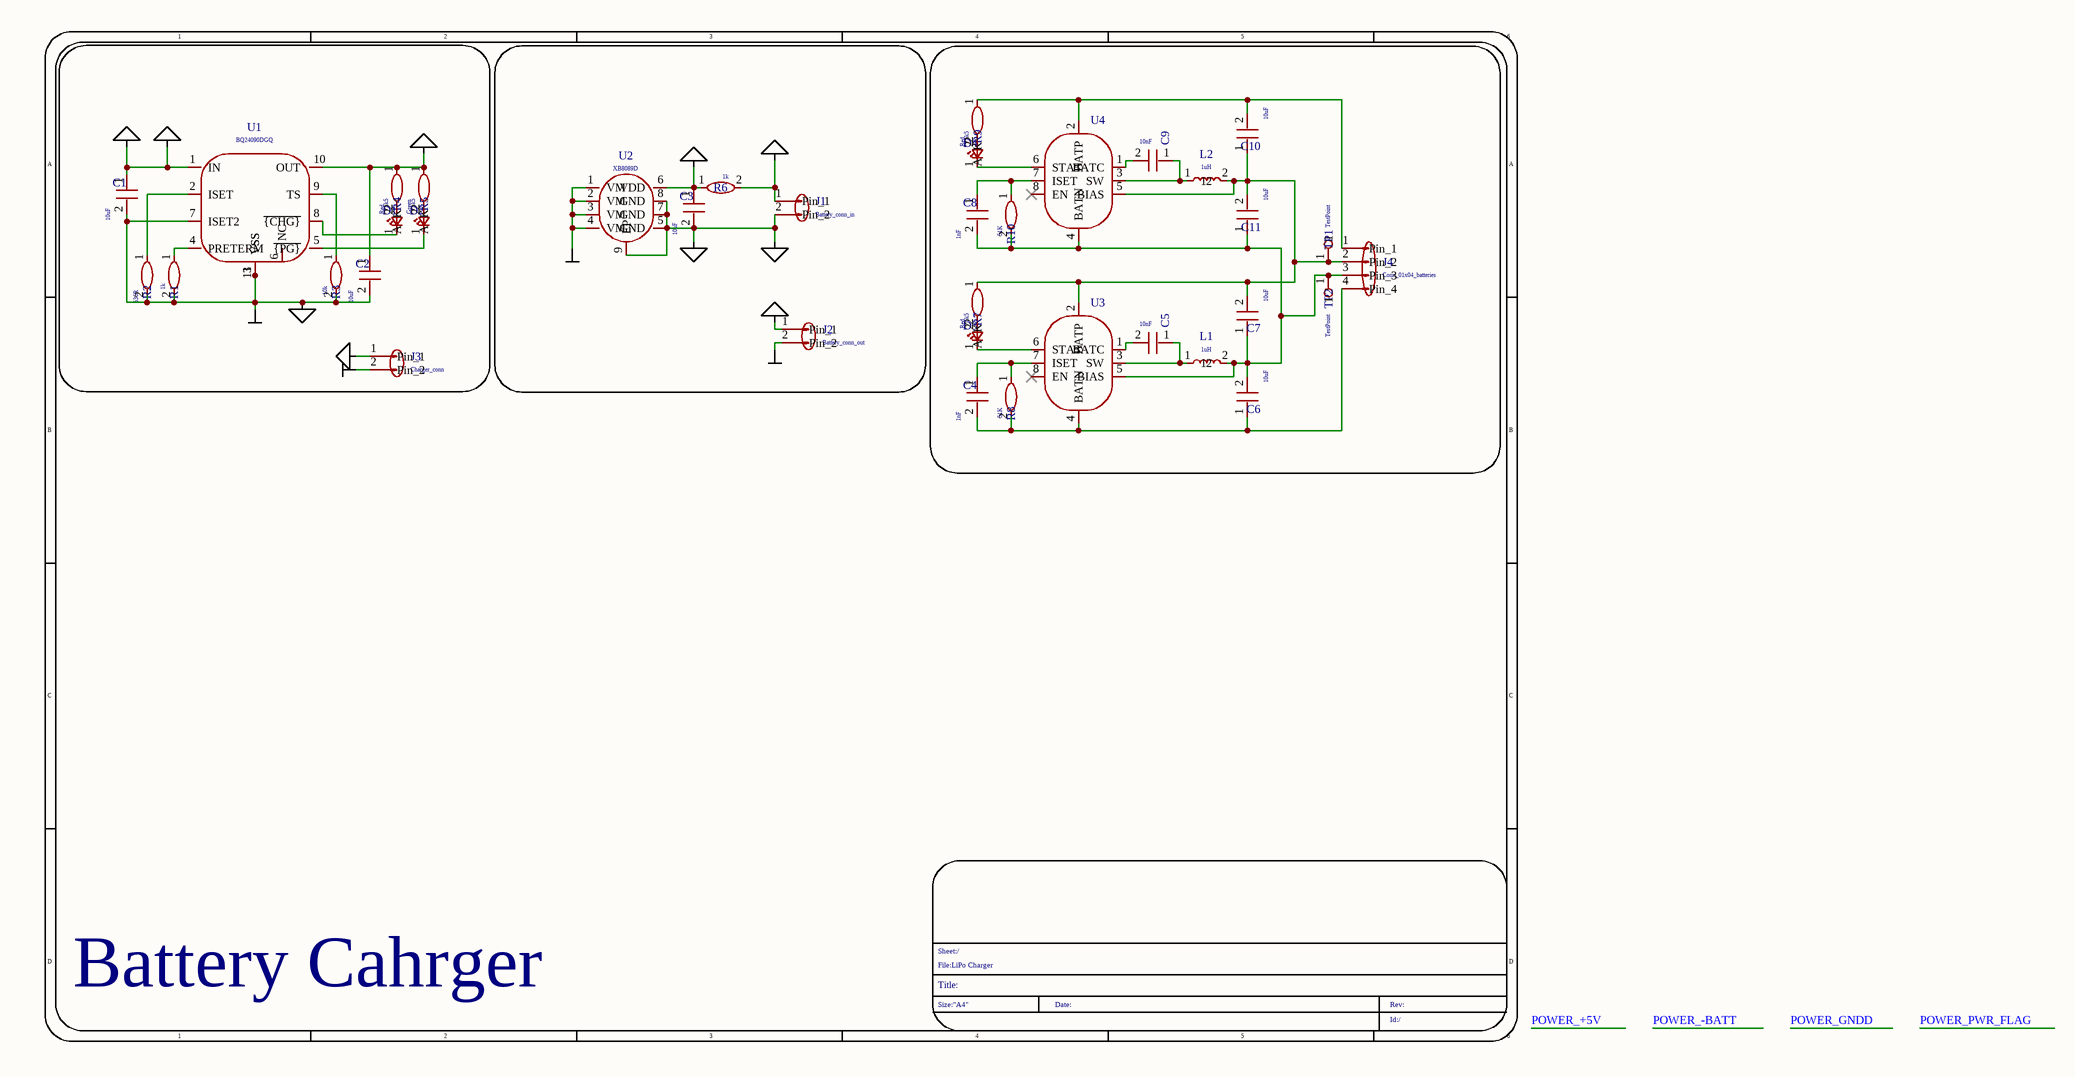
[diagram p11: 1_LiPo_Charger.schdoc]

### Parts
C1  value 10uF  [Capacitor_SMD:C_0402_1005Metric_Pad0.74x0.62mm_HandSolder]  (hidden comment: Device_C)
C2  value 10uF  [Capacitor_SMD:C_0402_1005Metric_Pad0.74x0.62mm_HandSolder]  (hidden comment: Device_C)
C3  value 10uF  [Capacitor_SMD:C_0402_1005Metric_Pad0.74x0.62mm_HandSolder]  (hidden comment: Device_C)
C4  value 1nF  [Capacitor_SMD:C_0402_1005Metric_Pad0.74x0.62mm_HandSolder]  (hidden comment: Device_C)
C5  value 10nF  [Capacitor_SMD:C_0402_1005Metric_Pad0.74x0.62mm_HandSolder]  (hidden comment: Device_C)
C6  value 10uF  [Capacitor_SMD:C_0402_1005Metric_Pad0.74x0.62mm_HandSolder]  (hidden comment: Device_C)
C7  value 10uF  [Capacitor_SMD:C_0402_1005Metric_Pad0.74x0.62mm_HandSolder]  (hidden comment: Device_C)
C8  value 1nF  [Capacitor_SMD:C_0402_1005Metric_Pad0.74x0.62mm_HandSolder]  (hidden comment: Device_C)
C9  value 10nF  [Capacitor_SMD:C_0402_1005Metric_Pad0.74x0.62mm_HandSolder]  (hidden comment: Device_C)
C10  value 10uF  [Capacitor_SMD:C_0402_1005Metric_Pad0.74x0.62mm_HandSolder]  (hidden comment: Device_C)
C11  value 10uF  [Capacitor_SMD:C_0402_1005Metric_Pad0.74x0.62mm_HandSolder]  (hidden comment: Device_C)
D1  value Red  [SparkFun-LED:LED_0603_1608Metric_Red]  (hidden comment: SparkFun-LED_LED_Red_0603)
D2  value Green  [SparkFun-LED:LED_0603_1608Metric_Green]  (hidden comment: SparkFun-LED_LED_Green_0603)
D3  value Red  [SparkFun-LED:LED_0603_1608Metric_Red]  (hidden comment: SparkFun-LED_LED_Red_0603)
D4  value Red  [SparkFun-LED:LED_0603_1608Metric_Red]  (hidden comment: SparkFun-LED_LED_Red_0603)
J1  value Battery_conn_in  [Connector_JST:JST_PH_B2B-PH-K_1x02_P2.00mm_Vertical]  (hidden comment: Connector_Generic_Conn_01x02)
J2  value Battery_conn_out  [Connector_JST:JST_PH_B2B-PH-K_1x02_P2.00mm_Vertical]  (hidden comment: Connector_Generic_Conn_01x02)
J3  value Charger_conn  [Connector_JST:JST_PH_B2B-PH-K_1x02_P2.00mm_Vertical]  (hidden comment: Connector_Generic_Conn_01x02)
J4  value Conn_01x04_batteries  [Connector_JST:JST_EH_B4B-EH-A_1x04_P2.50mm_Vertical]  (hidden comment: Connector_Generic_Conn_01x04)
L1  value 1uH  [Inductor_SMD:L_Sunlord_SWPA3010S]  (hidden comment: Device_L)
L2  value 1uH  [Inductor_SMD:L_Sunlord_SWPA3010S]  (hidden comment: Device_L)
R1  value 1k  [PCM_Resistor_SMD_AKL:R_0201_0603Metric_Pad0.64x0.40mm_HandSolder]  (hidden comment: Device_R)
R2  value 536R  [PCM_Resistor_SMD_AKL:R_0201_0603Metric_Pad0.64x0.40mm_HandSolder]  (hidden comment: Device_R)
R3  value 10k  [PCM_Resistor_SMD_AKL:R_0201_0603Metric_Pad0.64x0.40mm_HandSolder]  (hidden comment: Device_R)
R4  value 1k5  [PCM_Resistor_SMD_AKL:R_0201_0603Metric_Pad0.64x0.40mm_HandSolder]  (hidden comment: Device_R)
R5  value 1k5  [PCM_Resistor_SMD_AKL:R_0201_0603Metric_Pad0.64x0.40mm_HandSolder]  (hidden comment: Device_R)
R6  value 1k  [PCM_Resistor_SMD_AKL:R_0201_0603Metric_Pad0.64x0.40mm_HandSolder]  (hidden comment: Device_R)
R7  value 1k5  [PCM_Resistor_SMD_AKL:R_0201_0603Metric_Pad0.64x0.40mm_HandSolder]  (hidden comment: Device_R)
R8  value 51K  [PCM_Resistor_SMD_AKL:R_0201_0603Metric_Pad0.64x0.40mm_HandSolder]  (hidden comment: Device_R)
R9  value 1k5  [PCM_Resistor_SMD_AKL:R_0201_0603Metric_Pad0.64x0.40mm_HandSolder]  (hidden comment: Device_R)
R10  value 51K  [PCM_Resistor_SMD_AKL:R_0201_0603Metric_Pad0.64x0.40mm_HandSolder]  (hidden comment: Device_R)
TP1  value TestPoint  [TestPoint:TestPoint_Pad_D1.5mm]  (hidden comment: Connector_TestPoint)
TP2  value TestPoint  [TestPoint:TestPoint_Pad_D1.5mm]  (hidden comment: Connector_TestPoint)
U1  value BQ24090DGQ  [Package_SO:HVSSOP-10-1EP_3x3mm_P0.5mm_EP1.57x1.88mm_ThermalVias]  (hidden comment: Battery_Management_BQ24090DGQ)
U2  value XB8089D  [Package_SO:HTSOP-8-1EP_3.9x4.9mm_P1.27mm_EP2.4x3.2mm_ThermalVias]  (hidden comment: Chineness_XB8089D)
U3  Chineness_ETA3000  [Package_DFN_QFN:DFN-8-1EP_2x2mm_P0.5mm_EP0.6x1.2mm]  (value not drawn)
U4  Chineness_ETA3000  [Package_DFN_QFN:DFN-8-1EP_2x2mm_P0.5mm_EP0.6x1.2mm]  (value not drawn)

### Nets
POWER_+5V: C1.1 C1.2 C2.2 C3.1 C3.2 J1.2(Pin_2) J2.2(Pin_2) J3.1(Pin_1) J3.2(Pin_2) R1.2 R2.2 R3.2 R6.1 U1.1(IN) U1.3(VSS) U1.7(ISET2) U1.11(VSS) U2.1(VM) U2.2(VM) U2.3(VM) U2.4(VM) U2.5(GND) U2.6(VDD) U2.7(GND) U2.8(GND) U2.9(EP)  [also labelled POWER_-BATT, POWER_GNDD, POWER_PWR_FLAG]
POWER_+BATT: C2.1 J1.1(Pin_1) J2.1(Pin_1) R4.1 R5.1 R6.2 U1.10(OUT)
NetC4_1: C4.1 R8.1 U3.7(ISET)
NetC4_2: C4.2 C6.1 J4.4(Pin_4) R8.2 U3.4(BATN)
NetC5_1: C5.1 L1.1 U3.3(SW)
NetC5_2: C5.2 U3.1(BATC)
NetC6_2: C6.2 C7.1 C8.2 C11.1 J4.3(Pin_3) L1.2 R10.2 TP2.1 U3.5(BIAS) U4.4(BATN)
NetC7_2: C7.2 C10.1 C11.2 J4.2(Pin_2) L2.2 R7.1 TP1.1 U3.2(BATP) U4.5(BIAS)
NetC8_1: C8.1 R10.1 U4.7(ISET)
NetC9_1: C9.1 L2.1 U4.3(SW)
NetC9_2: C9.2 U4.1(BATC)
NetC10_2: C10.2 J4.1(Pin_1) R9.1 U4.2(BATP)
NetD1_1: D1.1(K) U1.8(~{{CHG}})
NetD1_2: D1.2(A) R4.2
NetD2_1: D2.1(K) U1.5(~{{PG}})
NetD2_2: D2.2(A) R5.2
NetD3_1: D3.1(K) U3.6(STAT)
NetD3_2: D3.2(A) R7.2
NetD4_1: D4.1(K) U4.6(STAT)
NetD4_2: D4.2(A) R9.2
NetR1_1: R1.1 U1.4(PRETERM)
NetR2_1: R2.1 U1.2(ISET)
NetR3_1: R3.1 U1.9(TS)

Not connected (* = marked no-connect by the designer): U1 6(NC); U3 8(EN)*; U4 8(EN)*

### Channels
Battery Charger: designators end in _Battery_Charger#1
Battery Charger: designators end in _Battery_Charger#2

### Notes on the sheet
- Battery Cahrger
- 1
- 2
- 3
- 4
- 5
- 6
- A
- B
- C
- D
- File:LiPo Charger
- Sheet:/
- Size:"A4"
- Title:
- Date:
- Rev:
- Id:/

### Library data of the parts
C1-C11 = Device_C: Users: REF**; ki_fp_filters: C_*; Add into BOM: yes; Symbol: Device_C; Device: Device_C; datasheet: ~; User doc link: ~; Convert to PCB: yes; Origin Footprint: Capacitor_SMD:C_0402_1005Metric_Pad0.74x0.62mm_HandSolder
D1 D3 D4 = SparkFun-LED_LED_Red_0603: prod_id: DIO-17976; ki_fp_filters: LED* LED_SMD:* LED_THT:*; Add into BOM: yes; Symbol: SparkFun-LED_LED_Red_0603; Device: SparkFun-LED_LED_Red_0603; datasheet: https://docs.broadcom.com/docs/AV02-0551EN; User doc link: https://docs.broadcom.com/docs/AV02-0551EN; Convert to PCB: yes; Origin Footprint: SparkFun-LED:LED_0603_1608Metric_Red; PROD_ID: DIO-17976
D2 = SparkFun-LED_LED_Green_0603: prod_id: DIO-00821; ki_fp_filters: LED* LED_SMD:* LED_THT:*; Add into BOM: yes; Symbol: SparkFun-LED_LED_Green_0603; Device: SparkFun-LED_LED_Green_0603; datasheet: https://docs.broadcom.com/docs/AV02-0551EN; User doc link: https://docs.broadcom.com/docs/AV02-0551EN; Convert to PCB: yes; Origin Footprint: SparkFun-LED:LED_0603_1608Metric_Green; PROD_ID: DIO-00821
J1-J3 = Connector_Generic_Conn_01x02: Users: REF**; ki_fp_filters: Connector*:*_1x??_*; Add into BOM: yes; Symbol: Connector_Generic_Conn_01x02; Device: Connector_Generic_Conn_01x02; datasheet: ~; User doc link: ~; Convert to PCB: yes; Origin Footprint: Connector_JST:JST_PH_B2B-PH-K_1x02_P2.00mm_Vertical
J4 = Connector_Generic_Conn_01x04: Users: REF**; ki_fp_filters: Connector*:*_1x??_*; Add into BOM: yes; Symbol: Connector_Generic_Conn_01x04; Device: Connector_Generic_Conn_01x04; datasheet: ~; User doc link: ~; Convert to PCB: yes; Origin Footprint: Connector_JST:JST_EH_B4B-EH-A_1x04_P2.50mm_Vertical
L1 L2 = Device_L: Users: REF**; ki_fp_filters: Choke_* *Coil* Inductor_* L_*; Add into BOM: yes; Symbol: Device_L; Device: Device_L; datasheet: ~; User doc link: ~; Convert to PCB: yes; Origin Footprint: Inductor_SMD:L_Sunlord_SWPA3010S
R1-R10 = Device_R: Users: REF**; ki_fp_filters: R_*; Add into BOM: yes; Symbol: Device_R; Device: Device_R; datasheet: ~; User doc link: ~; Convert to PCB: yes; Origin Footprint: PCM_Resistor_SMD_AKL:R_0201_0603Metric_Pad0.64x0.40mm_HandSolder
TP1 TP2 = Connector_TestPoint: Users: REF**; ki_fp_filters: Pin* Test*; Add into BOM: yes; Symbol: Connector_TestPoint; Device: Connector_TestPoint; datasheet: ~; User doc link: ~; Convert to PCB: yes; Origin Footprint: TestPoint:TestPoint_Pad_D1.5mm
U1 = Battery_Management_BQ24090DGQ: Users: REF**; ki_fp_filters: HVSSOP*1EP*3x3mm*P0.5mm*; Add into BOM: yes; Symbol: Battery_Management_BQ24090DGQ; Device: Battery_Management_BQ24090DGQ; datasheet: http://www.ti.com/lit/ds/symlink/bq24090.pdf; User doc link: http://www.ti.com/lit/ds/symlink/bq24090.pdf; Convert to PCB: yes; Origin Footprint: Package_SO:HVSSOP-10-1EP_3x3mm_P0.5mm_EP1.57x1.88mm_ThermalVias
U2 = Chineness_XB8089D: Users: REF**; ki_fp_filters: SOP-8-1EP; Add into BOM: yes; Symbol: Chineness_XB8089D; Device: Chineness_XB8089D; Convert to PCB: yes; Origin Footprint: Package_SO:HTSOP-8-1EP_3.9x4.9mm_P1.27mm_EP2.4x3.2mm_ThermalVias
U3 U4 = Chineness_ETA3000: Users: REF**; Add into BOM: yes; Symbol: Chineness_ETA3000; Device: Chineness_ETA3000; Value: ETA3000; Convert to PCB: yes; Origin Footprint: Package_DFN_QFN:DFN-8-1EP_2x2mm_P0.5mm_EP0.6x1.2mm

## Sheet BMS_Schematic1.schdoc
size 289 x 200 mm; Name: default297x210; Symbol: default297x210; Device: default297x210; Size: "A4"; Id: /; File: BMS Schematic; Sheet: /; SheetNumber: 14; SheetTotal: 17
Used 2 times, as channels Battery BMS_li_b, Battery BMS_li_b. Parts and nets are listed once, with the designators drawn on the sheet.
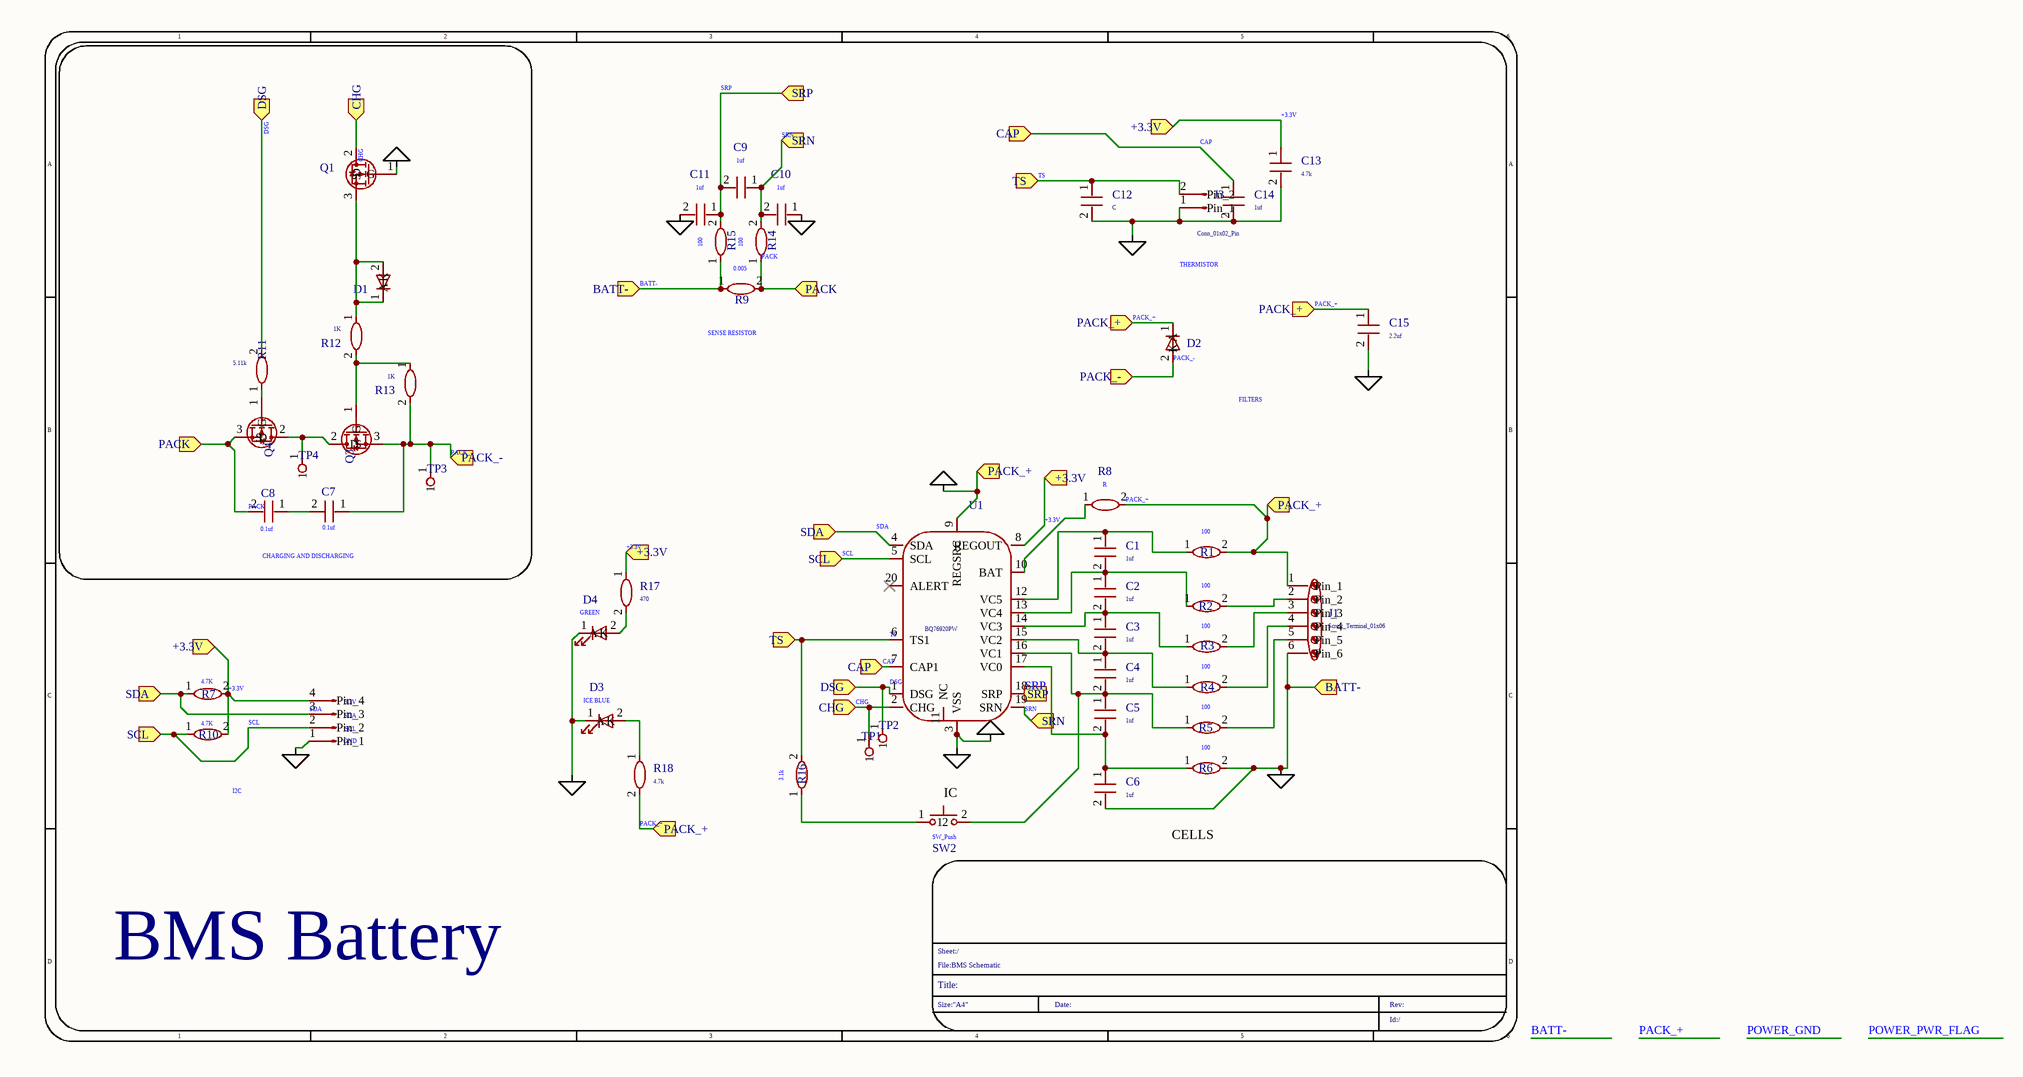
[diagram p12: BMS_Schematic1.schdoc]

### Parts
C1  value 1uf  (hidden comment: Device_C)
C2  value 1uf  (hidden comment: Device_C)
C3  value 1uf  (hidden comment: Device_C)
C4  value 1uf  (hidden comment: Device_C)
C5  value 1uf  (hidden comment: Device_C)
C6  value 1uf  (hidden comment: Device_C)
C7  value 0.1uf  (hidden comment: Device_C)
C8  value 0.1uf  (hidden comment: Device_C)
C9  value 1uf  (hidden comment: Device_C)
C10  value 1uf  (hidden comment: Device_C)
C11  value 1uf  (hidden comment: Device_C)
C12  value C  (hidden comment: Device_C)
C13  value 4.7k  (hidden comment: Device_C)
C14  value 1uf  (hidden comment: Device_C)
C15  value 2.2uf  (hidden comment: Device_C)
D1  Device_D  (value not drawn)
D2  Device_D  (value not drawn)
D3  value ICE BLUE  (hidden comment: Device_LED)
D4  value GREEN  (hidden comment: Device_LED)
J1  value Screw_Terminal_01x06  (hidden comment: Connector_Screw_Terminal_01x06)
J2  Connector_Conn_01x04_Pin  (value not drawn)
J3  value Conn_01x02_Pin  (hidden comment: Connector_Conn_01x02_Pin)
Q1  Transistor_FET_IRLZ44N  (value not drawn)
Q3  Transistor_FET_IRLZ44N  (value not drawn)
Q4  Transistor_FET_IRLZ44N  (value not drawn)
R1  value 100  (hidden comment: Device_R)
R2  value 100  (hidden comment: Device_R)
R3  value 100  (hidden comment: Device_R)
R4  value 100  (hidden comment: Device_R)
R5  value 100  (hidden comment: Device_R)
R6  value 100  (hidden comment: Device_R)
R7  value 4.7K  (hidden comment: Device_R)
R8  value R  (hidden comment: Device_R)
R9  value 0.005  (hidden comment: Device_R)
R10  value 4.7K  (hidden comment: Device_R)
R11  value 5.11k  (hidden comment: Device_R)
R12  value 1K  (hidden comment: Device_R)
R13  value 1K  (hidden comment: Device_R)
R14  value 100  (hidden comment: Device_R)
R15  value 100  (hidden comment: Device_R)
R16  value 3.1k  (hidden comment: Device_R)
R17  value 470  (hidden comment: Device_R)
R18  value 4.7k  (hidden comment: Device_R)
SW2  value SW_Push  (hidden comment: Switch_SW_Push)
TP1  Connector_TestPoint  (value not drawn)
TP2  Connector_TestPoint  (value not drawn)
TP3  Connector_TestPoint  (value not drawn)
TP4  Connector_TestPoint  (value not drawn)
U1  value BQ76920PW  (hidden comment: Battery_Management_BQ76920PW)

### Blocks framed on the sheet
CHARGING AND DISCHARGING: C7 C8 D1 Q1 Q3 Q4 R11-R13 TP3 TP4

### Ports
+3.3V (in), BATT- (in), CAP (in), CHG (in), DSG (in), PACK (in), PACK_+ (in), PACK_- (in), SCL (in), SDA (in), SRN (in), SRP (in), TS (in)

### Nets
BATT-: C6.2 C10.1 C11.2 C12.2 C13.2 C14.2 C15.1 C15.2 D2.1(K) D3.1(K) D4.1(K) J1.1(Pin_1) J1.6(Pin_6) J2.1(Pin_1) J3.1(Pin_1) Q1.1(G) R1.2 R6.2 R8.2 R9.1 R15.1 R18.2 U1.3(VSS) U1.9(REGSRC) ; port PACK_+, port BATT-  [also labelled PACK_+, POWER_GND, POWER_PWR_FLAG]
+3.3V: C13.1 J2.4(Pin_4) R7.2 R10.2 R17.1 U1.8(REGOUT) ; port +3.3V
CAP: C14.1 U1.7(CAP1) ; port CAP
CHG: Q1.2(D) TP1.1 U1.2(CHG) ; port CHG
DSG: R11.2 TP2.1 U1.1(DSG) ; port DSG
PACK: C8.2 Q4.3(S) R9.2 R14.1 ; port PACK
PACK_-: C7.1 D2.2(A) Q3.3(S) R13.2 TP3.1 ; port PACK_-
SCL: J2.2(Pin_2) R10.1 U1.5(SCL) ; port SCL
SDA: J2.3(Pin_3) R7.1 U1.4(SDA) ; port SDA
SRN: C9.1 C10.2 R14.2 U1.19(SRN) ; port SRN
SRP: C9.2 C11.1 R15.2 U1.18(SRP) ; port SRP
TS: C12.1 J3.2(Pin_2) R16.2 U1.6(TS1) ; port TS
NetC1_1: C1.1 R1.1 U1.12(VC5)
NetC1_2: C1.2 C2.1 R2.1 U1.13(VC4)
NetC2_2: C2.2 C3.1 R3.1 U1.14(VC3)
NetC3_2: C3.2 C4.1 R4.1 U1.15(VC2)
NetC4_2: C4.2 C5.1 R5.1 SW2.2 U1.16(VC1)
NetC5_2: C5.2 C6.1 R6.1 U1.17(VC0)
NetC7_2: C7.2 C8.1
NetD1_1: D1.1(K) D1.2(A) Q1.3(S) R12.1
NetD3_2: D3.2(A) R18.1
NetD4_2: D4.2(A) R17.2
NetJ1_2: J1.2(Pin_2) R2.2
NetJ1_3: J1.3(Pin_3) R3.2
NetJ1_4: J1.4(Pin_4) R4.2
NetJ1_5: J1.5(Pin_5) R5.2
NetQ3_1: Q3.1(G) R12.2 R13.1
NetQ3_2: Q3.2(D) Q4.2(D) TP4.1
NetQ4_1: Q4.1(G) R11.1
NetR8_1: R8.1 U1.10(BAT)
NetR16_1: R16.1 SW2.1

Not connected (* = marked no-connect by the designer): U1 11(NC) 20(ALERT)*

### Channels
Battery BMS_li_b: designators end in _Battery_BMS_li_b#1; ports +3.3V=+3.3V_Battery BMS_li_b BATT-=BATT- CAP=CAP_Battery BMS_li_b CHG=CHG_Battery BMS_li_b DSG=DSG_Battery BMS_li_b PACK=PACK_Battery BMS_li_b PACK_+=BATT- PACK_-=PACK_-_Battery BMS_li_b SCL=SCL_Battery BMS_li_b SDA=SDA_Battery BMS_li_b SRN=SRN_Battery BMS_li_b SRP=SRP_Battery BMS_li_b TS=TS_Battery BMS_li_b
Battery BMS_li_b: designators end in _Battery_BMS_li_b#2; ports +3.3V=+3.3V_Battery BMS_li_b BATT-=BATT- CAP=CAP_Battery BMS_li_b CHG=CHG_Battery BMS_li_b DSG=DSG_Battery BMS_li_b PACK=PACK_Battery BMS_li_b PACK_+=BATT- PACK_-=PACK_-_Battery BMS_li_b SCL=SCL_Battery BMS_li_b SDA=SDA_Battery BMS_li_b SRN=SRN_Battery BMS_li_b SRP=SRP_Battery BMS_li_b TS=TS_Battery BMS_li_b

### Notes on the sheet
- THERMISTOR
- (near R9) SENSE RESISTOR
- FILTERS
- (near J2) GND
- (near J2) SCL
- (near J2) 3.3V
- (near J2) SDA
- I2C
- (near SW2) IC
- CELLS
- BMS Battery
- 1
- 2
- 3
- 4
- 5
- 6
- A
- B
- C
- D
- File:BMS Schematic
- Sheet:/
- Size:"A4"
- Title:
- Date:
- Rev:
- Id:/

### Library data of the parts
C1-C15 = Device_C: Add into BOM: yes; Origin Footprint: Capacitor_SMD:C_0603_1608Metric_Pad1.08x0.95mm_HandSolder; Symbol: Device_C; Device: Device_C; User doc link: ~; Convert to PCB: yes
D1 = Device_D: Value: D; Sim_Pins: 1=K 2=A; Add into BOM: yes; Origin Footprint: Diode_SMD:D_0201_0603Metric; Symbol: Device_D; Device: Device_D; User doc link: ~; Sim_Device: D; Convert to PCB: yes; Sim.Device: D; Sim.Pins: 1=K 2=A
D2 = Device_D: Value: 30V; Sim_Device: D; Sim_Pins: 1=K 2=A; Add into BOM: yes; Origin Footprint: Diode_SMD:D_0201_0603Metric; Symbol: Device_D; Device: Device_D; User doc link: ~; Convert to PCB: yes; Sim.Device: D; Sim.Pins: 1=K 2=A
D3 D4 = Device_LED: Sim_Pins: 1=K 2=A; Add into BOM: yes; Origin Footprint: LED_SMD:LED_0805_2012Metric; Symbol: Device_LED; Device: Device_LED; User doc link: ~; Convert to PCB: yes; Sim.Pins: 1=K 2=A
J1 = Connector_Screw_Terminal_01x06: Add into BOM: yes; Origin Footprint: TerminalBlock:TerminalBlock_Xinya_XY308-2.54-6P_1x06_P2.54mm_Horizontal; Symbol: Connector_Screw_Terminal_01x06; Device: Connector_Screw_Terminal_01x06; User doc link: ~; Convert to PCB: yes
J2 = Connector_Conn_01x04_Pin: Add into BOM: yes; Origin Footprint: Connector_Samtec_HPM_THT:Samtec_HPM-04-01-x-S_Straight_1x04_Pitch5.08mm; Symbol: Connector_Conn_01x04_Pin; Device: Connector_Conn_01x04_Pin; Value: Conn_01x04_Pin; User doc link: ~; Convert to PCB: yes
J3 = Connector_Conn_01x02_Pin: Add into BOM: yes; Origin Footprint: Connector_Samtec_HPM_THT:Samtec_HPM-02-01-x-S_Straight_1x02_Pitch5.08mm; Symbol: Connector_Conn_01x02_Pin; Device: Connector_Conn_01x02_Pin; User doc link: ~; Convert to PCB: yes
Q1 Q3 Q4 = Transistor_FET_IRLZ44N: Add into BOM: yes; Origin Footprint: Package_TO_SOT_THT:TO-220-3_Vertical; Symbol: Transistor_FET_IRLZ44N; Device: Transistor_FET_IRLZ44N; Value: IRLZ44N; User doc link: http://www.irf.com/product-info/datasheets/data/irlz44n.pdf; Convert to PCB: yes
R1-R8 R10-R18 = Device_R: Add into BOM: yes; Origin Footprint: Resistor_SMD:R_0603_1608Metric_Pad0.98x0.95mm_HandSolder; Symbol: Device_R; Device: Device_R; User doc link: ~; Convert to PCB: yes
R9 = Device_R: Add into BOM: yes; Origin Footprint: Resistor_SMD:R_2512_6332Metric_Pad1.40x3.35mm_HandSolder; Symbol: Device_R; Device: Device_R; User doc link: ~; Convert to PCB: yes
SW2 = Switch_SW_Push: Add into BOM: yes; Origin Footprint: Button_Switch_SMD:SW_Tactile_SPST_NO_Straight_CK_PTS636Sx25SMTRLFS; Symbol: Switch_SW_Push; Device: Switch_SW_Push; User doc link: ~; Convert to PCB: yes
TP1-TP4 = Connector_TestPoint: Add into BOM: yes; Origin Footprint: TestPoint:TestPoint_THTPad_D1.0mm_Drill0.5mm; Symbol: Connector_TestPoint; Device: Connector_TestPoint; Value: TestPoint; User doc link: ~; Convert to PCB: yes
U1 = Battery_Management_BQ76920PW: Add into BOM: yes; Origin Footprint: Package_SO:TSSOP-20_4.4x6.5mm_P0.65mm; Symbol: Battery_Management_BQ76920PW; Device: Battery_Management_BQ76920PW; User doc link: http://www.ti.com/lit/ds/symlink/bq76920.pdf; Convert to PCB: yes

## Sheet bms1_bms.schdoc
size 289 x 200 mm; Name: default297x210; Symbol: default297x210; Device: default297x210; Size: "A4"; Id: /; File: bms; Sheet: /; SheetNumber: 13; SheetTotal: 17
Used 2 times, as channels Charging Orbit, Charging Orbit. Parts and nets are listed once, with the designators drawn on the sheet.
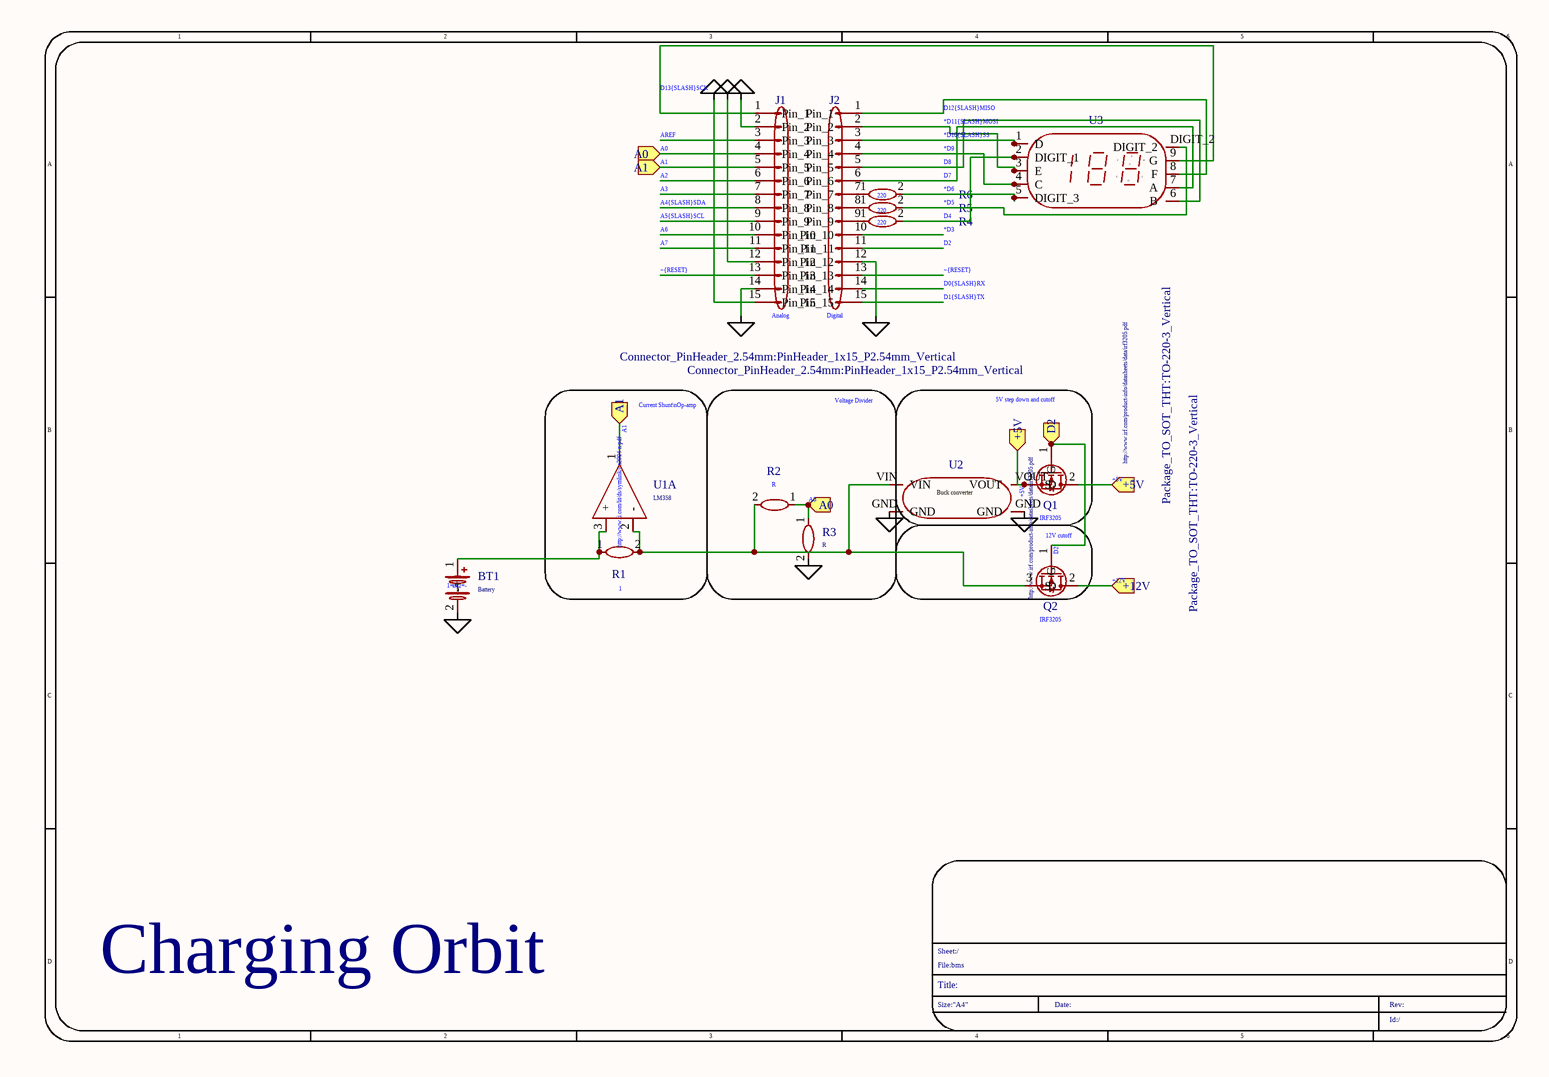
[diagram p13: bms1_bms.schdoc]

### Parts
BT1  value Battery  Sim.Device: V  Sim.Type: DC  Sim.Pins: 1=+ 2=-  (hidden comment: Device_Battery)
J1  value Analog  Origin Footprint: Connector_PinHeader_2.54mm:PinHeader_1x15_P2.54mm_Vertical  (hidden comment: Connector_Generic_Conn_01x15)
J2  value Digital  Origin Footprint: Connector_PinHeader_2.54mm:PinHeader_1x15_P2.54mm_Vertical  (hidden comment: Connector_Generic_Conn_01x15)
Q1  value IRF3205  Origin Footprint: Package_TO_SOT_THT:TO-220-3_Vertical  (hidden comment: Transistor_FET_IRF3205)
Q2  value IRF3205  Origin Footprint: Package_TO_SOT_THT:TO-220-3_Vertical  (hidden comment: Transistor_FET_IRF3205)
R1  value 1  (hidden comment: Device_R)
R2  value R  (hidden comment: Device_R)
R3  value R  (hidden comment: Device_R)
R4  value 220  (hidden comment: Device_R)
R5  value 220  (hidden comment: Device_R)
R6  value 220  (hidden comment: Device_R)
U1  value LM358  (hidden comment: Amplifier_Operational_LM358)  (part A of 3)
U2  buckconverter_buckconv  (value not drawn)
U3  New_Library_1led_E30401  (value not drawn)

### Blocks framed on the sheet
Current Shunt\nOp-amp: R1 U1
Voltage Divider: R2 R3
5V step down and cutoff: Q1 U2
12V cutoff: Q2

### Ports
+5V (in), +12V (in), A0 (in), A1 (in), D2 (in)

### Nets
POWER_+3.3V: J1.2(Pin_2)
POWER_+5V: J1.12(Pin_12)
POWER_GND: BT1.2(-) J1.14(Pin_14) J2.12(Pin_12) R3.2 U2.GND
POWER_VCC: J1.15(Pin_15)
*D3: J2.10(Pin_10)
*D5: R5.2 U3.DIGIT_2
*D6: R6.2 U3.5(DIGIT_3)
*D9: J2.4(Pin_4) U3.4(C)
*D10{SLASH}SS: J2.3(Pin_3) U3.1(D)
*D11{SLASH}MOSI: J2.2(Pin_2) U3.3(E)
+5V: Q1.2(D) Q1.3(S) U2.VOUT ; port +5V
+12V: Q2.2(D) ; port +12V
A0: J1.4(Pin_4) R2.1 R3.1 ; port A0
A1: J1.5(Pin_5) U1.1 ; port A1
A2: J1.6(Pin_6)
A3: J1.7(Pin_7)
A4{SLASH}SDA: J1.8(Pin_8)
A5{SLASH}SCL: J1.9(Pin_9)
A6: J1.10(Pin_10)
A7: J1.11(Pin_11)
AREF: J1.3(Pin_3)
D0{SLASH}RX: J2.14(Pin_14)
D1{SLASH}TX: J2.15(Pin_15)
D2: J2.11(Pin_11) Q1.1(G) Q2.1(G) ; port D2
D4: R4.2 U3.2(DIGIT_1)
D7: J2.6(Pin_6) U3.7(A)
D8: J2.5(Pin_5) U3.6(B)
D12{SLASH}MISO: J2.1(Pin_1) U3.8(F)
D13{SLASH}SCK: J1.1(Pin_1) U3.9(G)
~{RESET}: J1.13(Pin_13) J2.13(Pin_13)
NetBT1_1: BT1.1(+) R1.1 U1.3(+)
NetJ2_7: J2.7(Pin_7) R6.1
NetJ2_8: J2.8(Pin_8) R5.1
NetJ2_9: J2.9(Pin_9) R4.1
NetQ2_3: Q2.3(S) R1.2 R2.2 U1.2(-) U2.VIN

### Channels
Charging Orbit: designators end in _Charging_Orbit#1; ports +5V=+5V_Charging Orbit +12V=+12V_Charging Orbit A0=A0_Charging Orbit A1=A1_Charging Orbit D2=D2_Charging Orbit
Charging Orbit: designators end in _Charging_Orbit#2; ports +5V=+5V_Charging Orbit +12V=+12V_Charging Orbit A0=A0_Charging Orbit A1=A1_Charging Orbit D2=D2_Charging Orbit

### Notes on the sheet
- Charging Orbit
- 1
- 2
- 3
- 4
- 5
- 6
- A
- B
- C
- D
- File:bms
- Sheet:/
- Size:"A4"
- Title:
- Date:
- Rev:
- Id:/
- (in symbol buckconverter_buckconv) Buck converter

### Library data of the parts
BT1 = Device_Battery: Add into BOM: yes; Symbol: Device_Battery; Device: Device_Battery; Sim_Device: V; Sim_Type: DC; Sim_Pins: 1=+ 2=-; Convert to PCB: yes
J1 J2 = Connector_Generic_Conn_01x15: Add into BOM: yes; Symbol: Connector_Generic_Conn_01x15; Device: Connector_Generic_Conn_01x15; Convert to PCB: yes
Q1 Q2 = Transistor_FET_IRF3205: Add into BOM: yes; Symbol: Transistor_FET_IRF3205; Device: Transistor_FET_IRF3205; User doc link: http://www.irf.com/product-info/datasheets/data/irf3205.pdf; Convert to PCB: yes
R1-R6 = Device_R: Add into BOM: yes; Symbol: Device_R; Device: Device_R; Convert to PCB: yes
U1 = Amplifier_Operational_LM358: Add into BOM: yes; Symbol: Amplifier_Operational_LM358; Device: Amplifier_Operational_LM358; User doc link: http://www.ti.com/lit/ds/symlink/lm2904-n.pdf; Convert to PCB: yes
U2 = buckconverter_buckconv: Add into BOM: yes; Symbol: buckconverter_buckconv; Device: buckconverter_buckconv; Convert to PCB: yes
U3 = New_Library_1led_E30401: Add into BOM: yes; Symbol: New_Library_1led_E30401; Device: New_Library_1led_E30401; Convert to PCB: yes

## Sheet Solar_Part.SchDoc
size A4; SheetNumber: 17; SheetTotal: 17
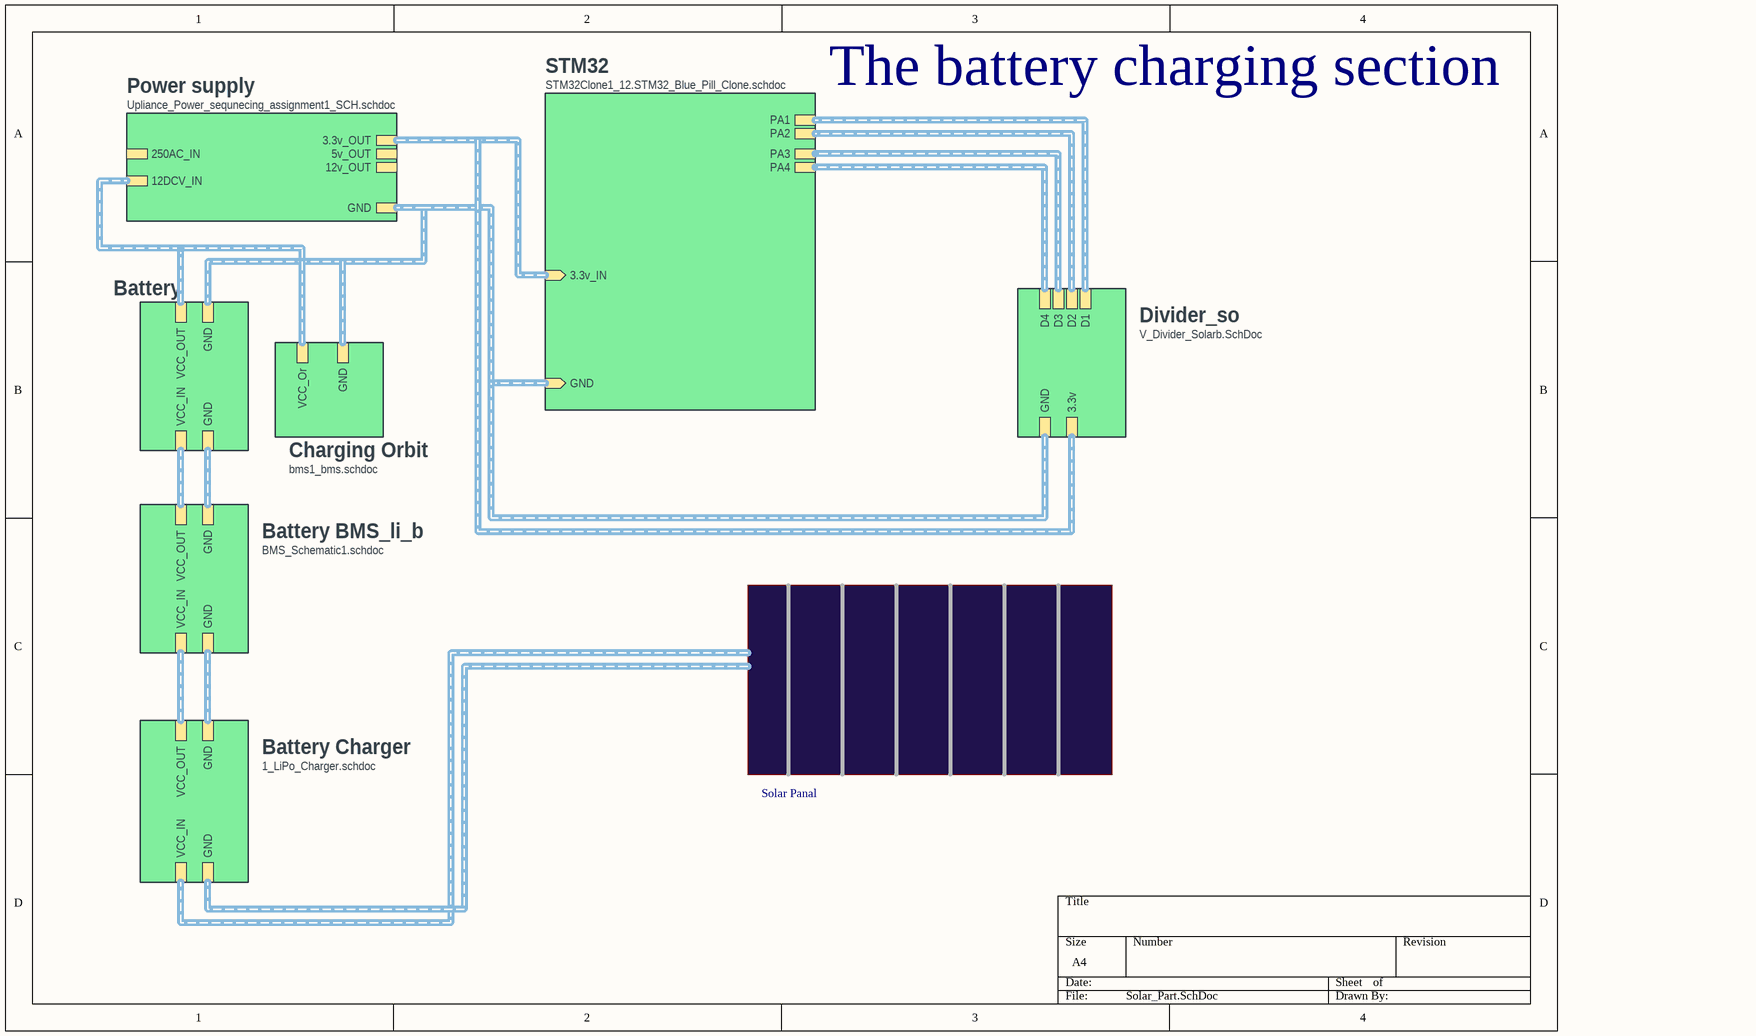
[diagram p14: Solar_Part.SchDoc]

### Sub-sheets
Battery = ?: VCC_IN (harness TWI), GND (harness TWI), VCC_OUT (harness USB_CC), GND (harness USB_CC)
Battery BMS_li_b = BMS_Schematic1.schdoc: VCC_IN (harness TWI), GND (harness TWI), VCC_OUT (harness USB_CC), GND (harness USB_CC)
Battery Charger = 1_LiPo_Charger.schdoc: GND (harness TWI), VCC_IN (harness TWI), VCC_OUT (harness USB_CC), GND (harness USB_CC)
Charging Orbit = bms1_bms.schdoc: GND (harness USB_CC), VCC_Or (harness USB_CC)
Divider_so = V_Divider_Solarb.SchDoc: D3 (harness USB_CC), D4 (harness USB_CC), D2 (harness USB_CC), D1 (harness USB_CC), GND (harness TWI), 3.3v (harness TWI)
Power supply = Upliance_Power_sequnecing_assignment1_SCH.schdoc: 12DCV_IN (harness TWI), 3.3v_OUT (harness USB_CC), GND (harness USB_CC), 5v_OUT (harness USB_CC), 12v_OUT (harness USB_CC), 250AC_IN (harness TWI)
STM32 = STM32Clone1_12.STM32_Blue_Pill_Clone.schdoc: PA1 (harness SWD), PA2 (harness TRACE), GND (in), 3.3v_IN (in), PA4 (harness GPIO_P0), PA3 (harness GPIO_P0)

### Buses and harness runs
harness sheet Battery BMS_li_b/GND = sheet Battery Charger/GND
harness sheet Battery BMS_li_b/GND = sheet Battery/GND
harness sheet Battery BMS_li_b/VCC_IN = sheet Battery Charger/VCC_OUT
harness sheet Battery BMS_li_b/VCC_OUT = sheet Battery/VCC_IN
harness sheet Battery/GND = sheet Charging Orbit/GND = sheet Divider_so/GND = sheet Power supply/GND = sheet STM32/GND
harness sheet Battery/VCC_OUT = sheet Charging Orbit/VCC_Or = sheet Power supply/12DCV_IN
harness sheet Divider_so/3.3v = sheet Power supply/3.3v_OUT = sheet STM32/3.3v_IN
harness sheet Divider_so/D1 = sheet STM32/PA1
harness sheet Divider_so/D2 = sheet STM32/PA2
harness sheet Divider_so/D3 = sheet STM32/PA3
harness sheet Divider_so/D4 = sheet STM32/PA4

### Notes on the sheet
- The battery charging section
- Solar Panal